# EAGLE design pcb_khamex_zenit_V0.1_rev_5.2 (EAGLE 7.6.0)

## Sheet 1 of 2
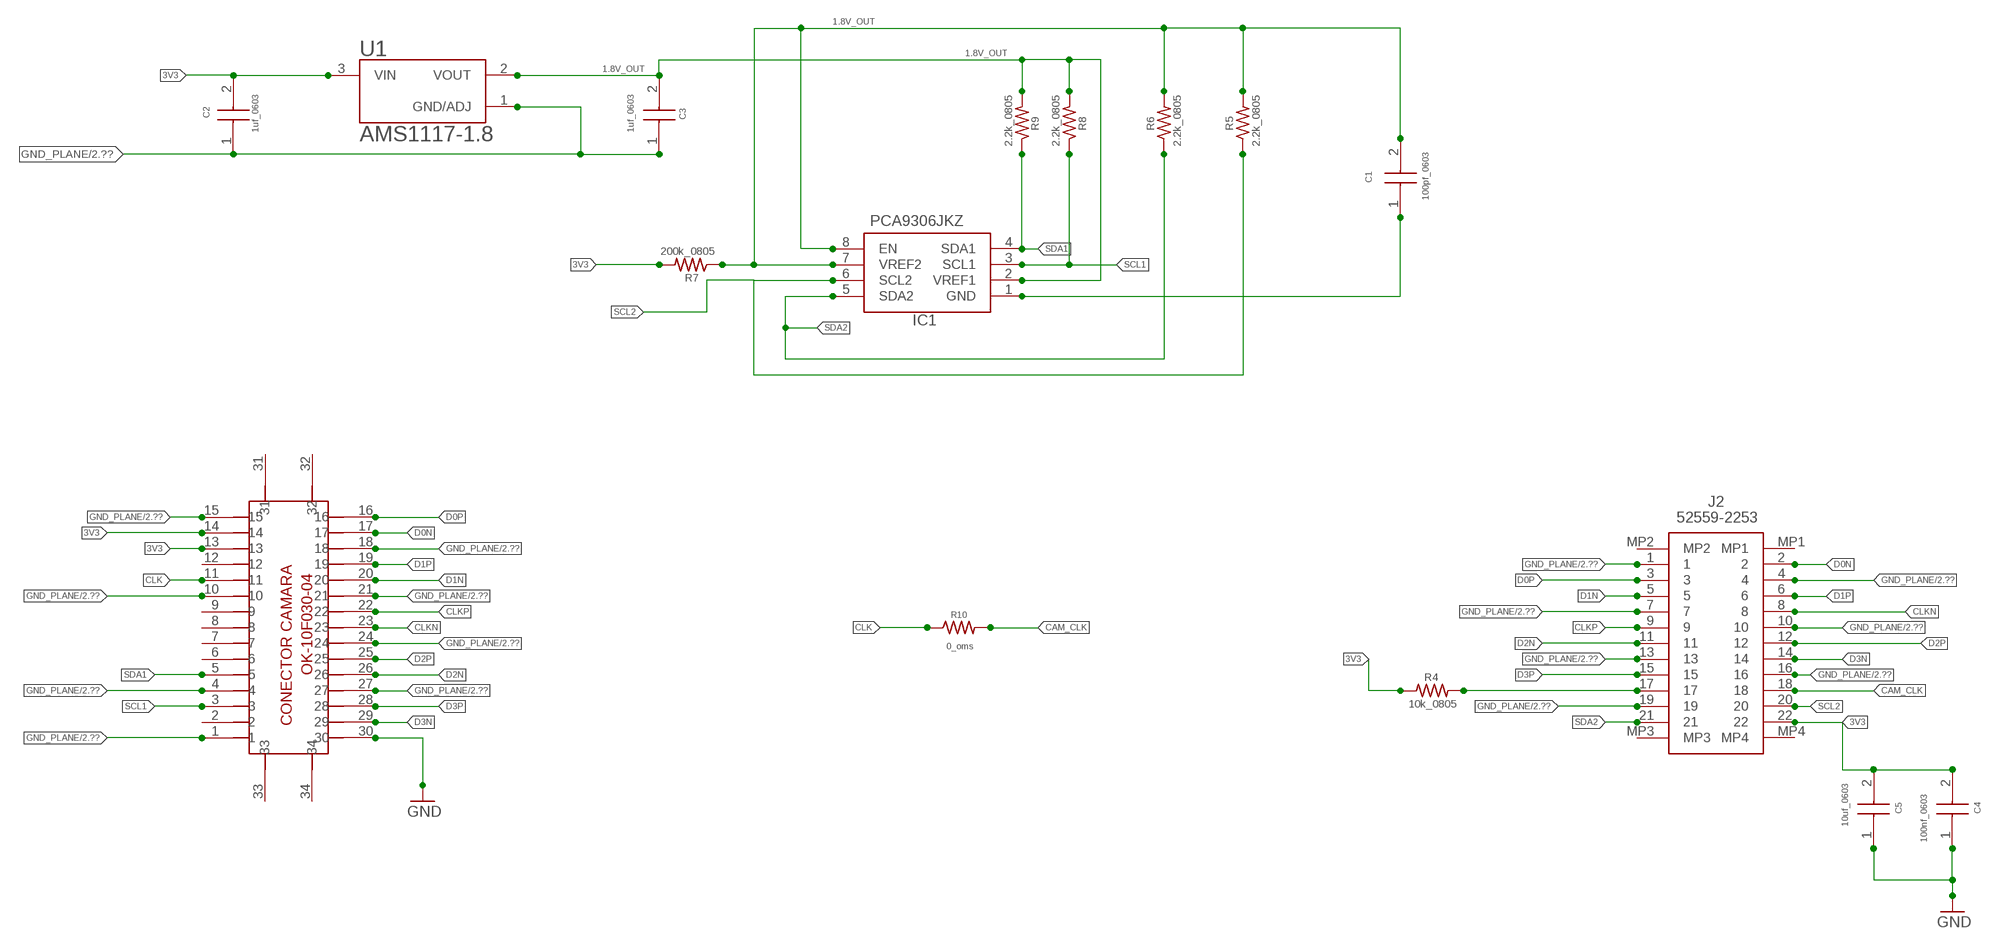
[diagram p0: schematic, sheet 1, part 1 of 2]
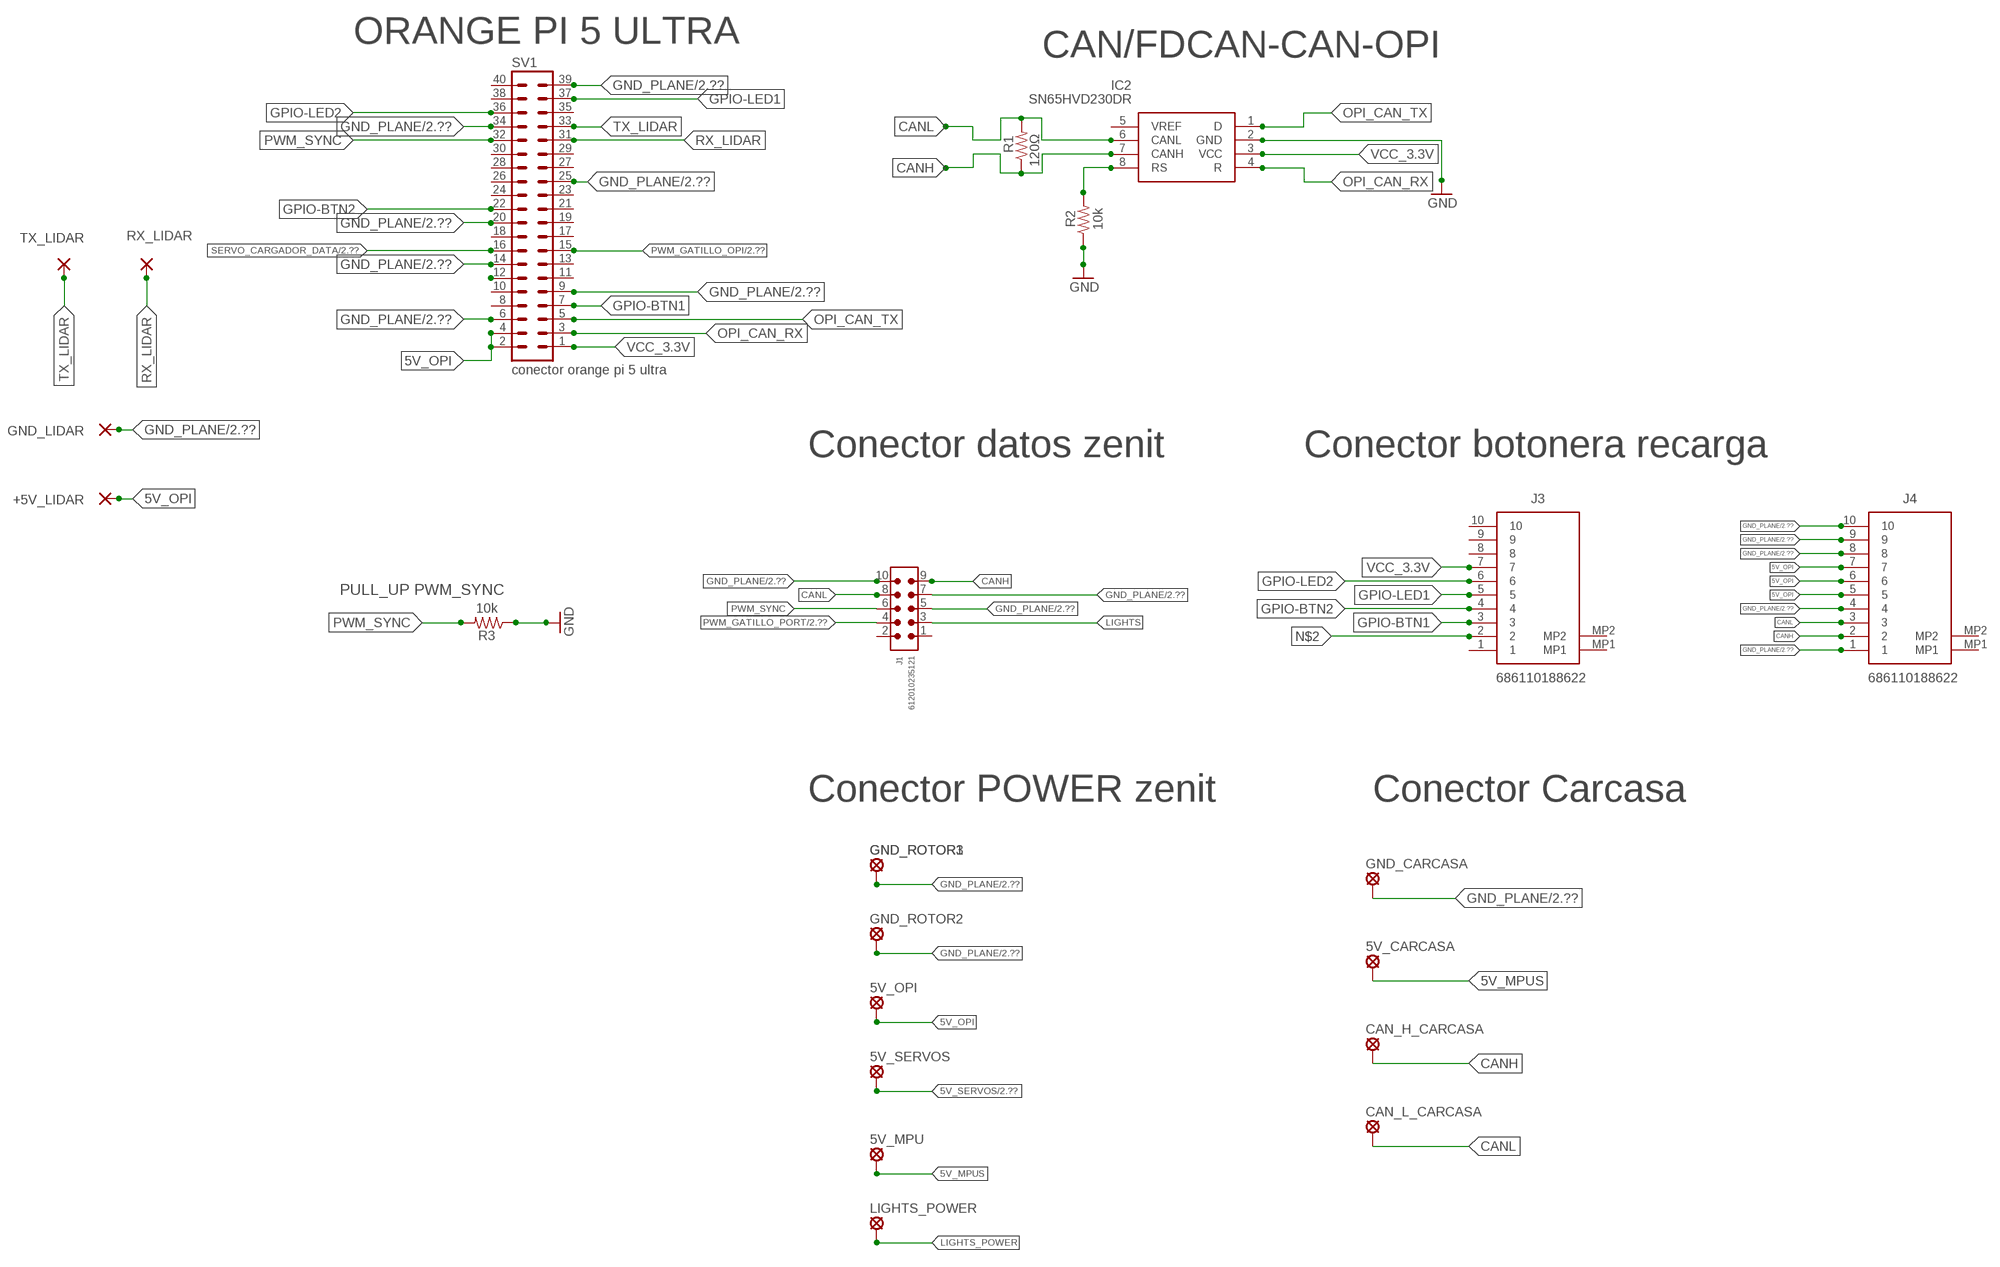
[diagram p1: schematic, sheet 1, part 2 of 2]

### Parts
5V_CARCASA  SE14  [SE14]
5V_MPU  SE14  [SE14]
5V_OPI  SE14  [SE14]
5V_SERVOS  SE14  [SE14]
+5V_LIDAR  WIREPAD1,6/0,8  [1,6/0,8]
C1  100pf_0603  06033U101FAT2A  [CAPC1608X90N]
C2  1uf_0603  06033U101FAT2A  [CAPC1608X90N]
C3  1uf_0603  06033U101FAT2A  [CAPC1608X90N]
C4  100nf_0603  06033U101FAT2A  [CAPC1608X90N]
C5  10uf_0603  06033U101FAT2A  [CAPC1608X90N]
CAN_H_CARCASA  SE14  [SE14]
CAN_L_CARCASA  SE14  [SE14]
GND_CARCASA  SE14  [SE14]
GND_LIDAR  WIREPAD1,6/0,8  [1,6/0,8]
GND_ROTOR1  SE14  [SE14]
GND_ROTOR2  SE14  [SE14]
GND_ROTOR3  SE14  [SE14]
IC1  PCA9306JKZ  [PCA9306JKZ]
IC2  SN65HVD230DR  [SOT127P600X175-8N]
J1  612010235121  6120XX235121_612010235121  [612010235121]
J2  52559-2253  [525592253]
J3  686110188622  [686110188622]
J4  686110188622  [686110188622]
LIGHTS_POWER  SE14  [SE14]
R1  120Ω  R-US_M0805  [M0805]
R2  10k  R-US_M0805  [M0805]
R3  10k  R-US_R0603  [R0603]
R4  10k_0805  R-US_M0805  [M0805]
R5  2.2k_0805  R-US_M0805  [M0805]
R6  2.2k_0805  R-US_M0805  [M0805]
R7  200k_0805  R-US_M0805  [M0805]
R8  2.2k_0805  R-US_M0805  [M0805]
R9  2.2k_0805  R-US_M0805  [M0805]
R10  0_oms  R-US_M0805  [M0805]
RX_LIDAR  WIREPAD1,6/0,8  [1,6/0,8]
SV1  conector orange pi 5 ultra  MA20-2  [MA20-2]
TX_LIDAR  WIREPAD1,6/0,8  [1,6/0,8]
U1  AMS1117-1.8  [SOT229P700X180-4N]
U$1  OK-10F030-04_DEVICE  [OK-10F030-04_PACKAGE]

### Nets
1.8V: C3.2 IC1.2(VREF1) R8.2 R9.2 U1.2(VOUT)
3V3 [power]: C2.2 C4.2 C5.2 J2.22 R4.1 R7.2 U1.3(VIN) U$1.13 U$1.14
5V_MPUS: 5V_CARCASA.MP 5V_MPU.MP
5V_OPI: 5V_OPI.MP +5V_LIDAR.1(P) J4.5 J4.6 J4.7 SV1.2 SV1.4
5V_SERVOS: 5V_SERVOS.MP ; also sheet 2
CAM_CLK: J2.18 R10.2
CANH: CAN_H_CARCASA.MP IC2.7(CANH) J1.9 J4.2 R1.1
CANL: CAN_L_CARCASA.MP IC2.6(CANL) J1.8 J4.3 R1.2
CLK: R10.1 U$1.11
CLKN: J2.8 U$1.23
CLKP: J2.9 U$1.22
D0N: J2.2 U$1.17
D0P: J2.3 U$1.16
D1N: J2.5 U$1.20
D1P: J2.6 U$1.19
D2N: J2.11 U$1.26
D2P: J2.12 U$1.25
D3N: J2.14 U$1.29
D3P [power]: J2.15 U$1.28
GND_PLANE [power]: C2.1 C3.1 C4.1 C5.1 GND_CARCASA.MP GND_LIDAR.1(P) GND_ROTOR1.MP GND_ROTOR2.MP GND_ROTOR3.MP IC2.2(GND) J1.5 J1.7 J1.10 J2.1 J2.4 J2.7 J2.10 J2.13 J2.16 J2.19 J4.1 J4.4 J4.8 J4.9 J4.10 R2.1 R3.1 SV1.6 SV1.9 SV1.14 SV1.20 SV1.25 SV1.34 SV1.39 U1.1(GND/ADJ) U$1.1 U$1.4 U$1.10 U$1.15 U$1.18 U$1.21 U$1.24 U$1.27 U$1.30 ; supply symbol labelled GND ; also sheet 2
GPIO-BTN1: J3.3 SV1.7
GPIO-BTN2: J3.4 SV1.22
GPIO-LED1: J3.5 SV1.37
GPIO-LED2: J3.6 SV1.36
LIGHTS [power]: J1.3
LIGHTS_POWER [power]: LIGHTS_POWER.MP
N$1: C1.1 IC1.1(GND)
N$2: J3.2
N$6: C1.2 IC1.7(VREF2) IC1.8(EN) R5.2 R6.2 R7.1
N$7: J2.17 R4.2
N$9: SV1.12
N$15: IC2.8(RS) R2.2
OPI_CAN_RX: IC2.4(R) SV1.3
OPI_CAN_TX: IC2.1(D) SV1.5
PWM_GATILLO_OPI: SV1.15 ; also sheet 2
PWM_GATILLO_PORT: J1.4 ; also sheet 2
PWM_SYNC: J1.6 R3.2 SV1.32
RX_LIDAR: RX_LIDAR.1(P) SV1.31
SCL1: IC1.3(SCL1) R8.1 U$1.3
SCL2: IC1.6(SCL2) J2.20 R5.1
SDA1: IC1.4(SDA1) R9.1 U$1.5
SDA2: IC1.5(SDA2) J2.21 R6.1
SERVO_CARGADOR_DATA: SV1.16 ; also sheet 2
TX_LIDAR: SV1.33 TX_LIDAR.1(P)
VCC_3.3V: IC2.3(VCC) J3.7 SV1.1
Unconnected: IC2.5(VREF) J1.1 J1.2 J2.MP1 J2.MP2 J2.MP3 J2.MP4 J3.1 J3.8 J3.9 J3.10 J3.MP1 J3.MP2 J4.MP1 J4.MP2 SV1.8 SV1.10 SV1.11 SV1.13 SV1.17 SV1.18 SV1.19 SV1.21 SV1.23 SV1.24 SV1.26 SV1.27 SV1.28 SV1.29 SV1.30 SV1.35 SV1.38 SV1.40 U$1.2 U$1.6 U$1.7 U$1.8 U$1.9 U$1.12 U$1.31 U$1.32 U$1.33 U$1.34

### Notes on the sheet
- 1.8V_OUT
- 1.8V_OUT
- 1.8V_OUT
- ORANGE PI 5 ULTRA
- CAN/FDCAN-CAN-OPI
- Conector datos zenit | Conector botonera recarga
- PULL_UP PWM_SYNC
- Conector POWER zenit | Conector Carcasa

## Sheet 2 of 2
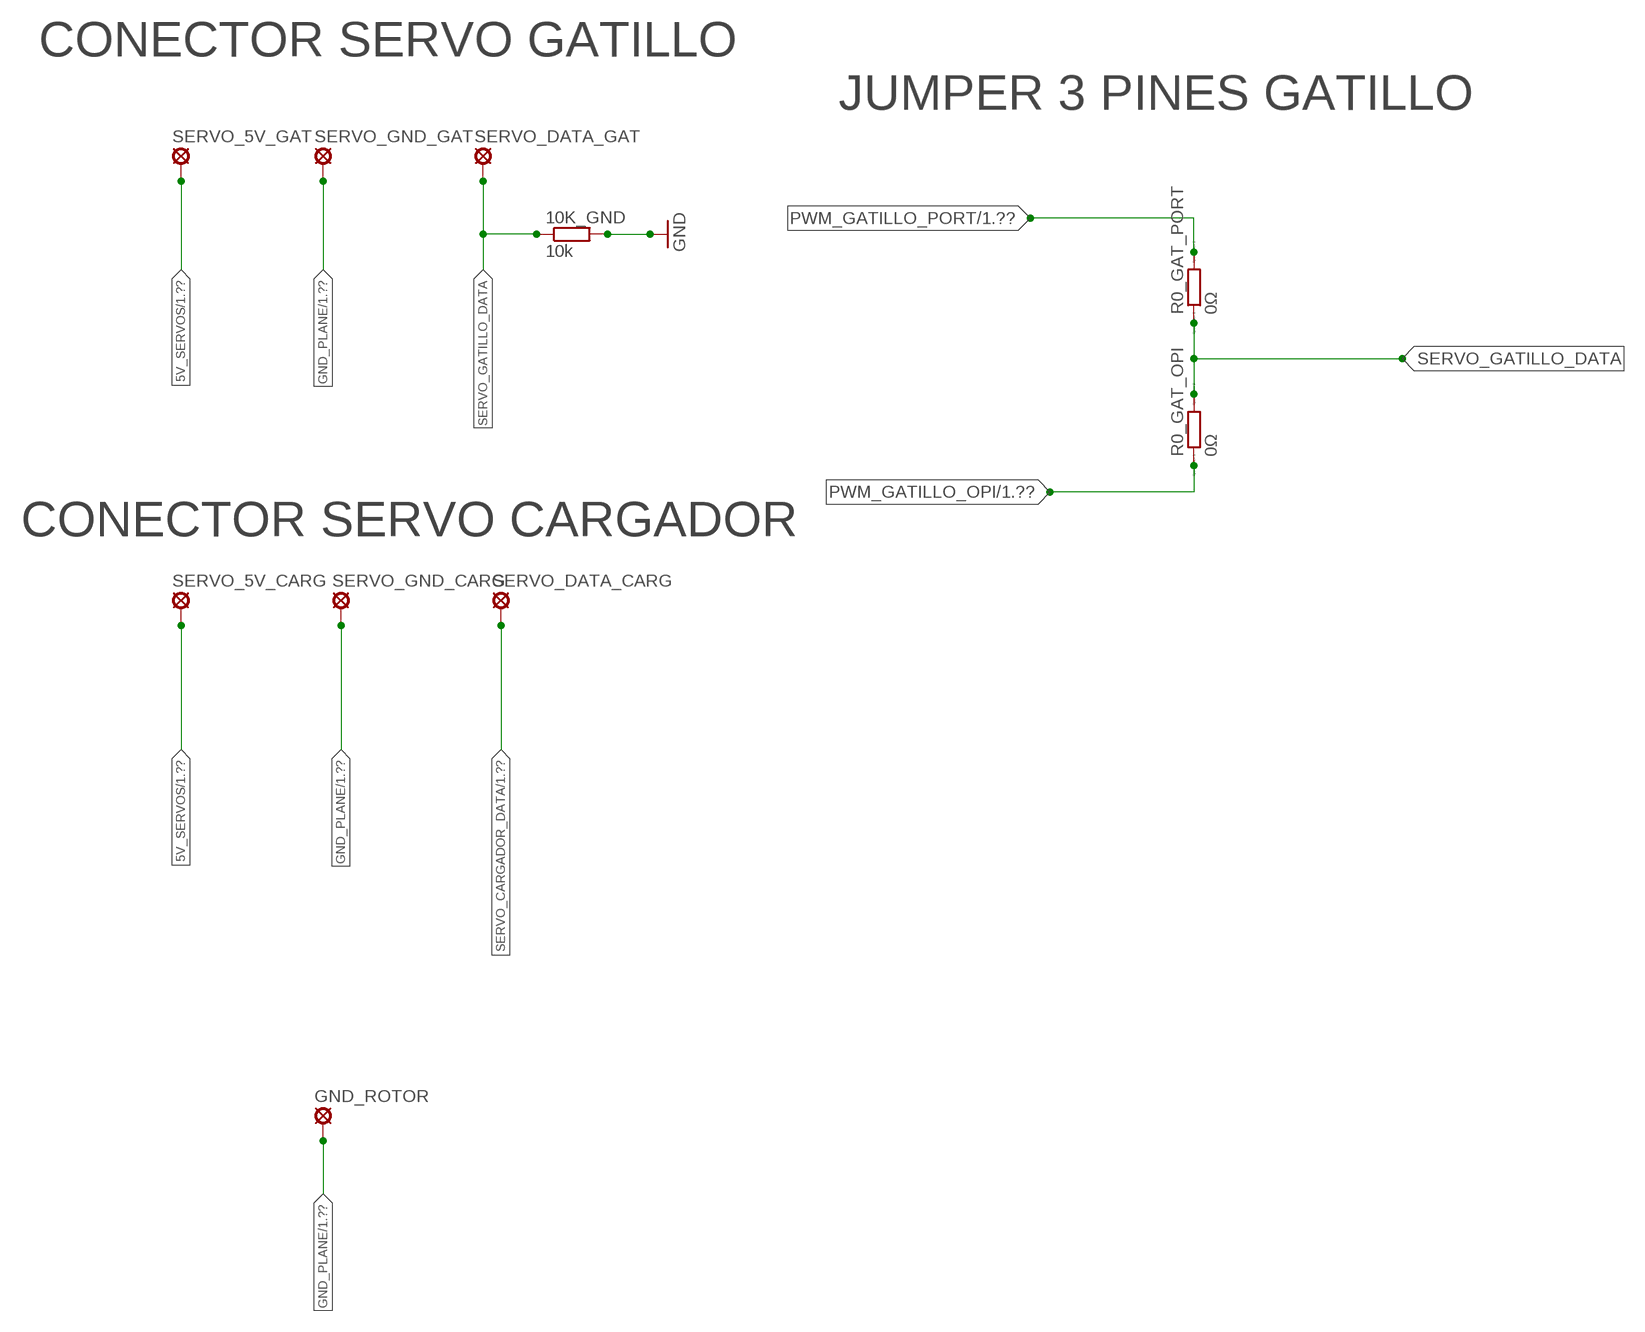
[diagram p2: schematic, sheet 2]

### Parts
10K_GND  10k  R-EU_R0603  [R0603]
GND_ROTOR  SE14  [SE14]
R0_GAT_OPI  0Ω  RR0603  [R0603]
R0_GAT_PORT  0Ω  RR0603  [R0603]
SERVO_5V_CARG  SE14  [SE14]
SERVO_5V_GAT  SE14  [SE14]
SERVO_DATA_CARG  SE14  [SE14]
SERVO_DATA_GAT  SE14  [SE14]
SERVO_GND_CARG  SE14  [SE14]
SERVO_GND_GAT  SE14  [SE14]

### Nets
5V_SERVOS: SERVO_5V_CARG.MP SERVO_5V_GAT.MP ; also sheet 1
GND_PLANE [power]: 10K_GND.2 GND_ROTOR.MP SERVO_GND_CARG.MP SERVO_GND_GAT.MP ; supply symbol labelled GND ; also sheet 1
PWM_GATILLO_OPI: R0_GAT_OPI.1 ; also sheet 1
PWM_GATILLO_PORT: R0_GAT_PORT.2 ; also sheet 1
SERVO_CARGADOR_DATA: SERVO_DATA_CARG.MP ; also sheet 1
SERVO_GATILLO_DATA: 10K_GND.1 R0_GAT_OPI.2 R0_GAT_PORT.1 SERVO_DATA_GAT.MP

### Notes on the sheet
- CONECTOR SERVO GATILLO
- JUMPER 3 PINES GATILLO
- CONECTOR SERVO CARGADOR

## Library data of the parts
5V_CARCASA 5V_MPU 5V_OPI 5V_SERVOS CAN_H_CARCASA CAN_L_CARCASA GND_CARCASA GND_ROTOR GND_ROTOR1-GND_ROTOR3 LIGHTS_POWER SERVO_5V_CARG SERVO_5V_GAT SERVO_DATA_CARG SERVO_DATA_GAT SERVO_GND_CARG SERVO_GND_GAT = solpad:SE14: SOLDER PAD E1553, drill 1,4mm, distributor Buerklin, 07F820
10K_GND = rcl_dani:R-EU_: RESISTOR, European symbol
+5V_LIDAR GND_LIDAR RX_LIDAR TX_LIDAR = wirepad:WIREPAD: Wire PAD connect wire on PCB
C1-C5 = 06033U101FAT2A:06033U101FAT2A: Multilayer Ceramic Capacitors MLCC - SMD/SMT 25V 100pF C0G 0603 1% Tol Source: Datasheet <https://componentsearchengine.com/Datasheets/1/06031A100FAT2A.pdf>; DESCRIPTION: Multilayer Ceramic Capacitors MLCC - SMD/SMT 25V 100pF C0G 0603 1% Tol; HEIGHT: 0.9mm; MANUFACTURER_NAME: Kyocera AVX; MANUFACTURER_PART_NUMBER: 06033U101FAT2A
IC1 = PCA9306JKZ:PCA9306JKZ: Voltage Level Translator Bidirectional 1 Circuit 2 Channel 8-X2SON (1.35x1) , 1.8 V ~ 5.5 V , -40C ~ 105C (TA) Source: Datasheet <https://www.nxp.com/docs/en/data-sheet/PCA9306.pdf>; DESCRIPTION: Voltage Level Translator Bidirectional 1 Circuit 2 Channel 8-X2SON (1.35x1) , 1.8 V ~ 5.5 V , -40C ~ 105C (TA); HEIGHT: 0.33mm; MANUFACTURER_NAME: NXP; MANUFACTURER_PART_NUMBER: PCA9306JKZ
IC2 = SN65HVD230DR:SN65HVD230DR: 3.3 V CAN Transceiver with Standby Mode Source: Datasheet <http://www.ti.com/lit/gpn/sn65hvd230>; DESCRIPTION: 3.3 V CAN Transceiver with Standby Mode; HEIGHT: 1.75mm; MANUFACTURER_NAME: Texas Instruments; MANUFACTURER_PART_NUMBER: SN65HVD230DR; MOUSER_PART_NUMBER: 595-SN65HVD230DR; MOUSER_PRICE-STOCK: https://www.mouser.co.uk/ProductDetail/Texas-Instruments/SN65HVD230DR?qs=QViXGNcIEAtifeQR3pYVUQ%3D%3D
J1 = Eagle_WR-BHD_rev24a:6120XX235121_612010235121: WR-BHD 2.54 mm Male Box Header High Temperature KIND PROPERTIES: Pitch 2.54 mm Gender:Male MATERIAL PROPERTIES: Insulator Material:PA6T Insulator Flammability Rating UL94 V-0 Insulator Color:Black Contact Material :Copper Alloy Contact Plating :Gold Contact Type: Stamped GENERAL INFORMATION: Operating Temperature:-40 °C up to +125 °C Compliance:RoHS Working Voltage: 250 V (AC) Withstanding Voltage:500 V (AC) Contact Resistance: 20 mΩ Insulation Resistance:1000 MΩ PACKAGING PROPERTIES Packaging :Tray <https://www.we-online.com/catalog/media/o32904v209%20Family_WR-BHD_6120xx235121.jpg> Details see: https://www.we-online.com/catalog/en/BHD_2_54_MALE_BOX_HEADER_HIGH_TEMPERATURE_6120XX235121 Updated by Ella Wu 2021-03-12 2021 (C) Würth Elektronik; CONTACT-RESISTANCE: 20mOhm; DATASHEET-URL: https://www.we-online.com/redexpert/spec/612010235121?ae; GENDER: Male; IR: 3A; LENGTH: 20.3mm; MOUNT: THT; PACKAGING: Tray; PART-NUMBER: 612010235121; PINS: 10; PITCH: 2.54mm; TYPE: Straight; WORKING-VOLTAGE: 250V(AC)
J2 = 52559-2253:52559-2253: 0.5 MM FPC CONNECTOR Source: Datasheet; DESCRIPTION: 0.5 MM FPC CONNECTOR; HEIGHT: 5.55mm; MANUFACTURER_NAME: Molex; MANUFACTURER_PART_NUMBER: 52559-2253; MOUSER_PART_NUMBER: 538-52559-2253; MOUSER_PRICE-STOCK: https://www.mouser.co.uk/ProductDetail/Molex/52559-2253?qs=nDwhpid8gJaCOR81Wp3jsw%3D%3D
J3 J4 = 686110188622:686110188622: FFC & FPC Connectors WR-FPC 1,0mm SMT Horiz. Top Contact Tin Plating{0000} Source: Datasheet <https://www.mouser.ch/datasheet/2/445/686110188622-1843591.pdf>; DESCRIPTION: FFC & FPC Connectors WR-FPC 1,0mm SMT Horiz. Top Contact Tin Plating{0000}; HEIGHT: 3.3mm; MANUFACTURER_NAME: Wurth Elektronik; MANUFACTURER_PART_NUMBER: 686110188622; MOUSER_PART_NUMBER: 710-686110188622; MOUSER_PRICE-STOCK: https://www.mouser.co.uk/ProductDetail/Wurth-Elektronik/686110188622?qs=OlC7AqGiEDnHUpT6yh27Lg%3D%3D
R0_GAT_OPI R0_GAT_PORT = eagle-ltspice:R: RESISTOR, European symbol; SPICEMODEL: NONE; SPICEPREFIX: R
R1-R10 = rcl:R-US_: RESISTOR, American symbol
SV1 = con-lstb:MA20-2: PIN HEADER; OC_FARNELL: unknown; OC_NEWARK: unknown
U1 = AMS1117-1.8 (1):AMS1117-1.8: Check availability <https://pricing.snapeda.com/parts/AMS1117-1.8-TR/ams/view-part?ref=eda>; AVAILABILITY: Not in stock; CHECK_PRICES: https://www.snapeda.com/parts/AMS1117-1.8-TR/ams/view-part/?ref=eda; MF: ams; MP: AMS1117-1.8-TR; PACKAGE: SOT-223 Seeed Technology; PRICE: None; SNAPEDA_LINK: https://www.snapeda.com/parts/AMS1117-1.8-TR/ams/view-part/?ref=snap
U$1 = OK-10F030-04_LIBRARY_2:OK-10F030-04_DEVICE: Conector para las camaras del Orange Pi 5 Ultra 30 pines click

## Net classes
0 default: width 0.15 mm, drill 0.3 mm, clearance 0.15 mm
1 power: width 0.127 mm, drill 0.305 mm, clearance 0.127 mm
2 thin: width 0.254 mm, drill 0.254 mm, clearance 0.254 mm
3 mipi: width 0.15 mm, drill 0.2 mm, clearance 0.15 mm

## Board
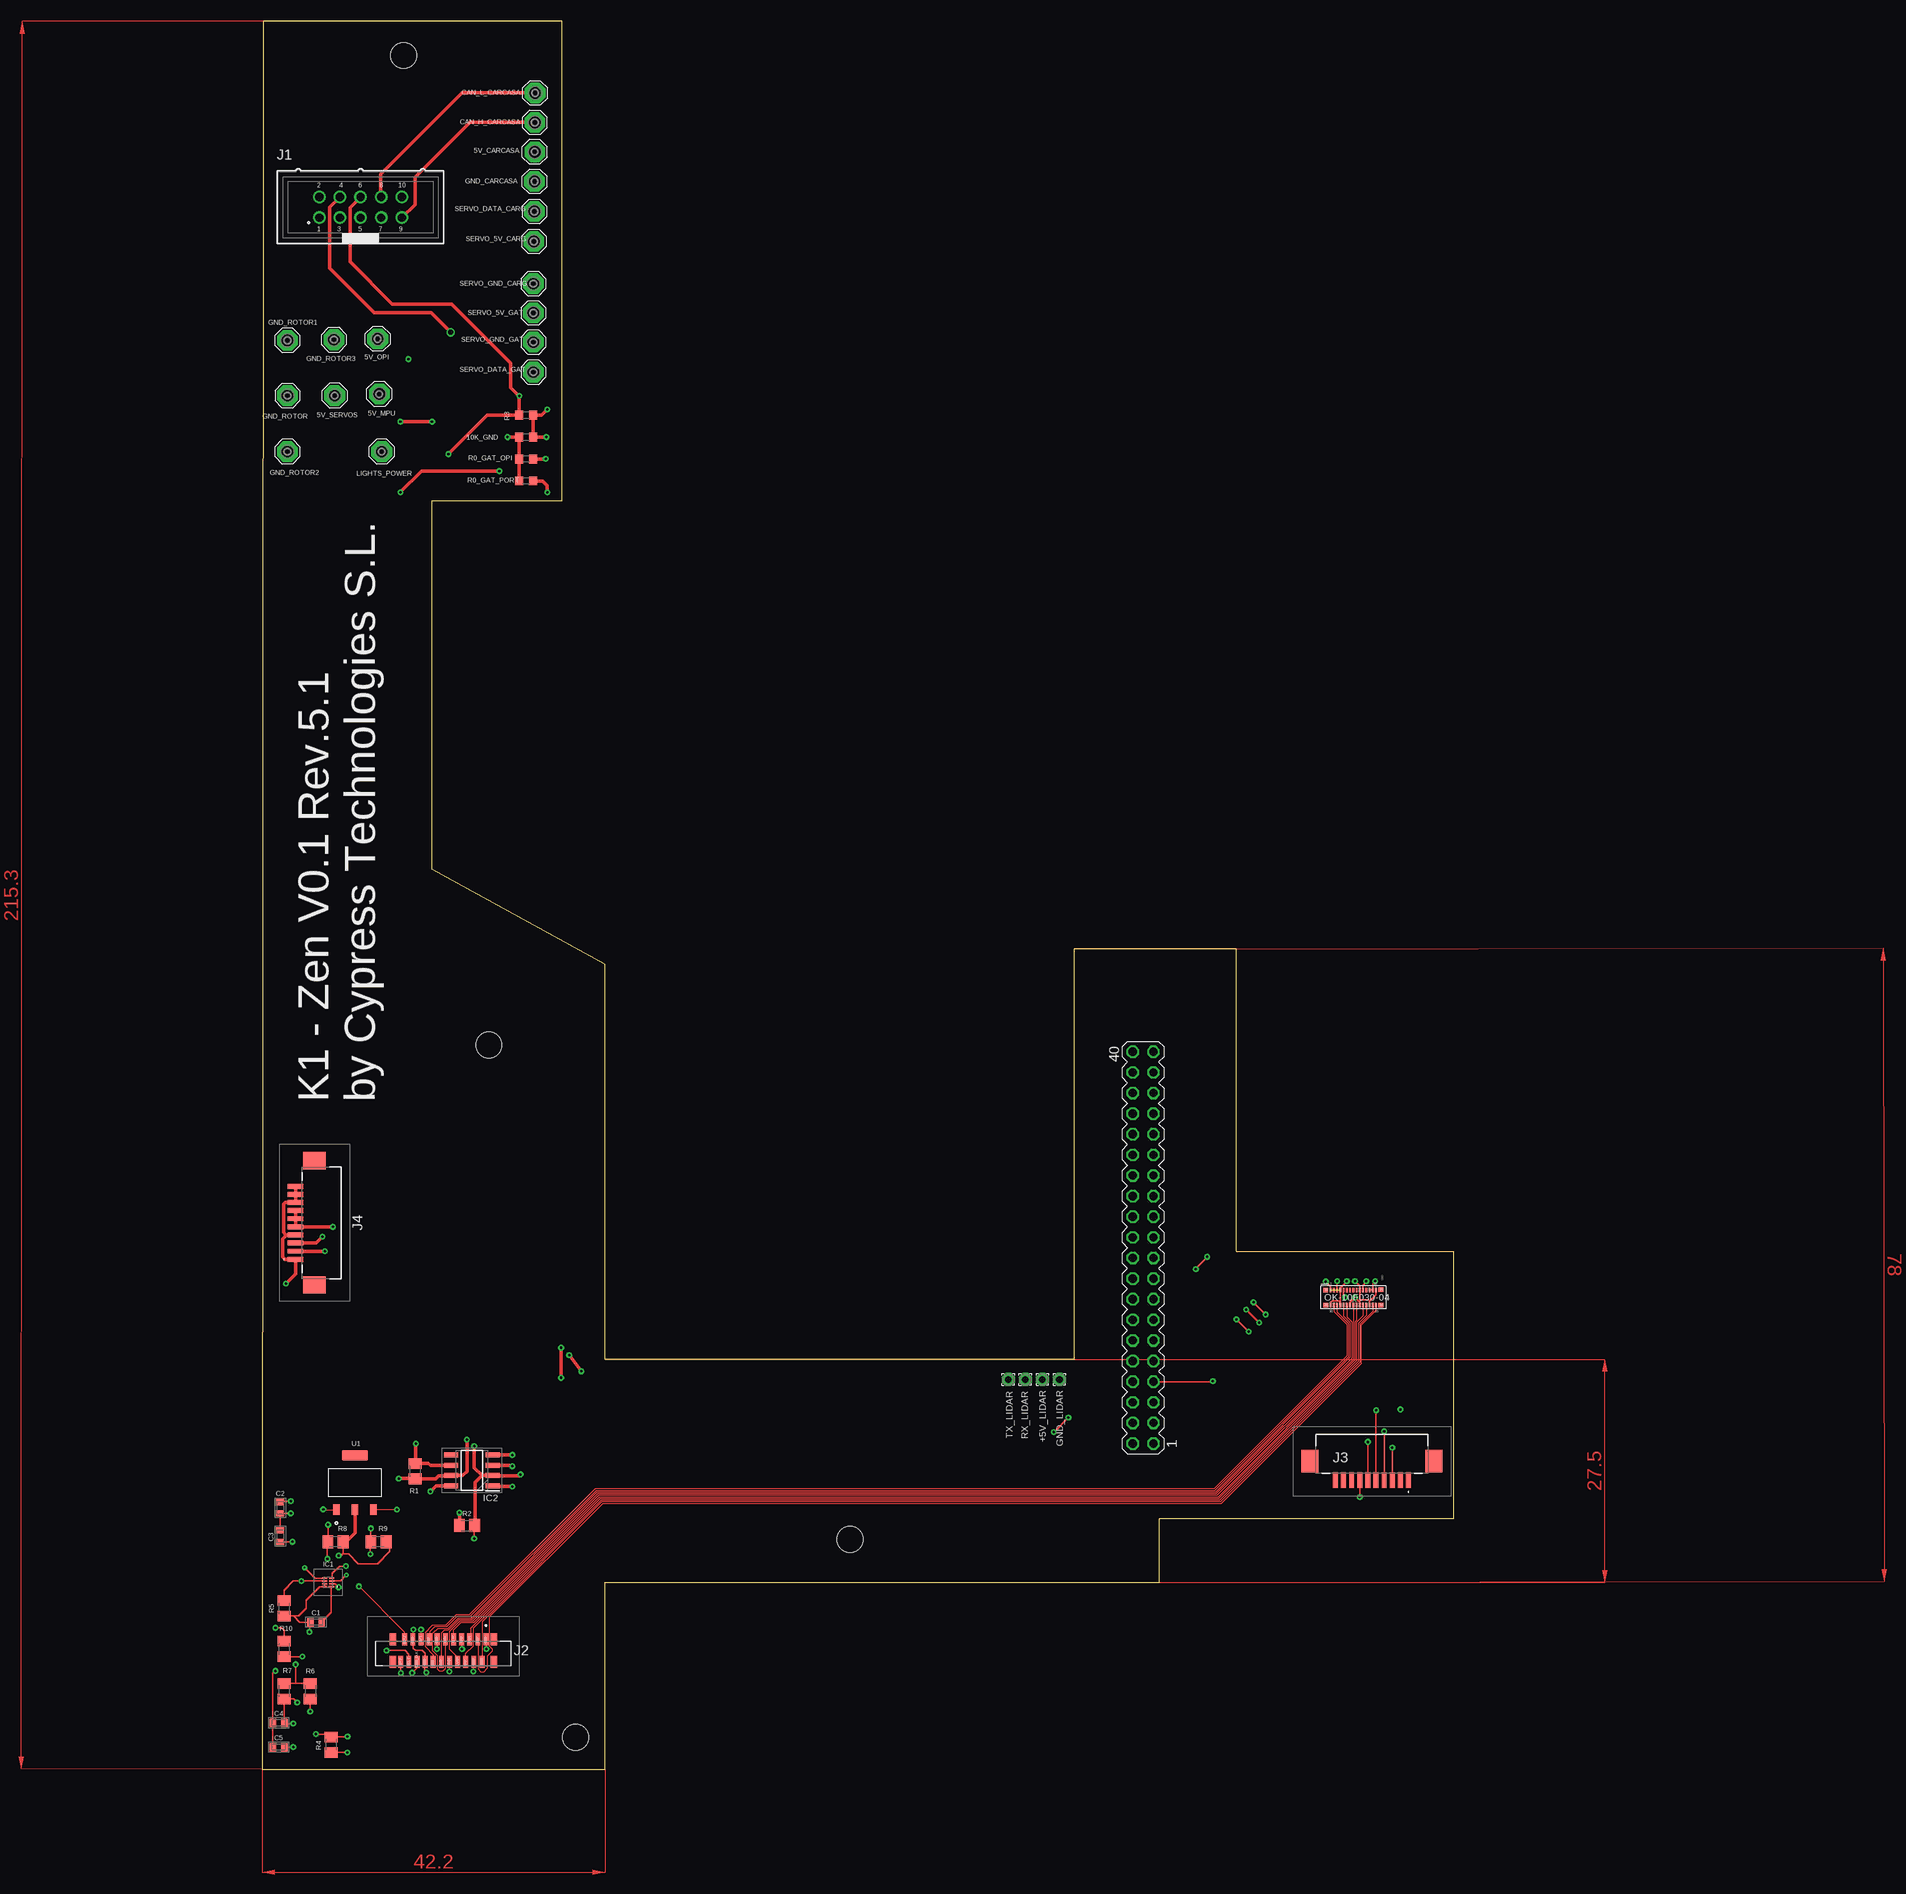
[diagram p3: board, top side]
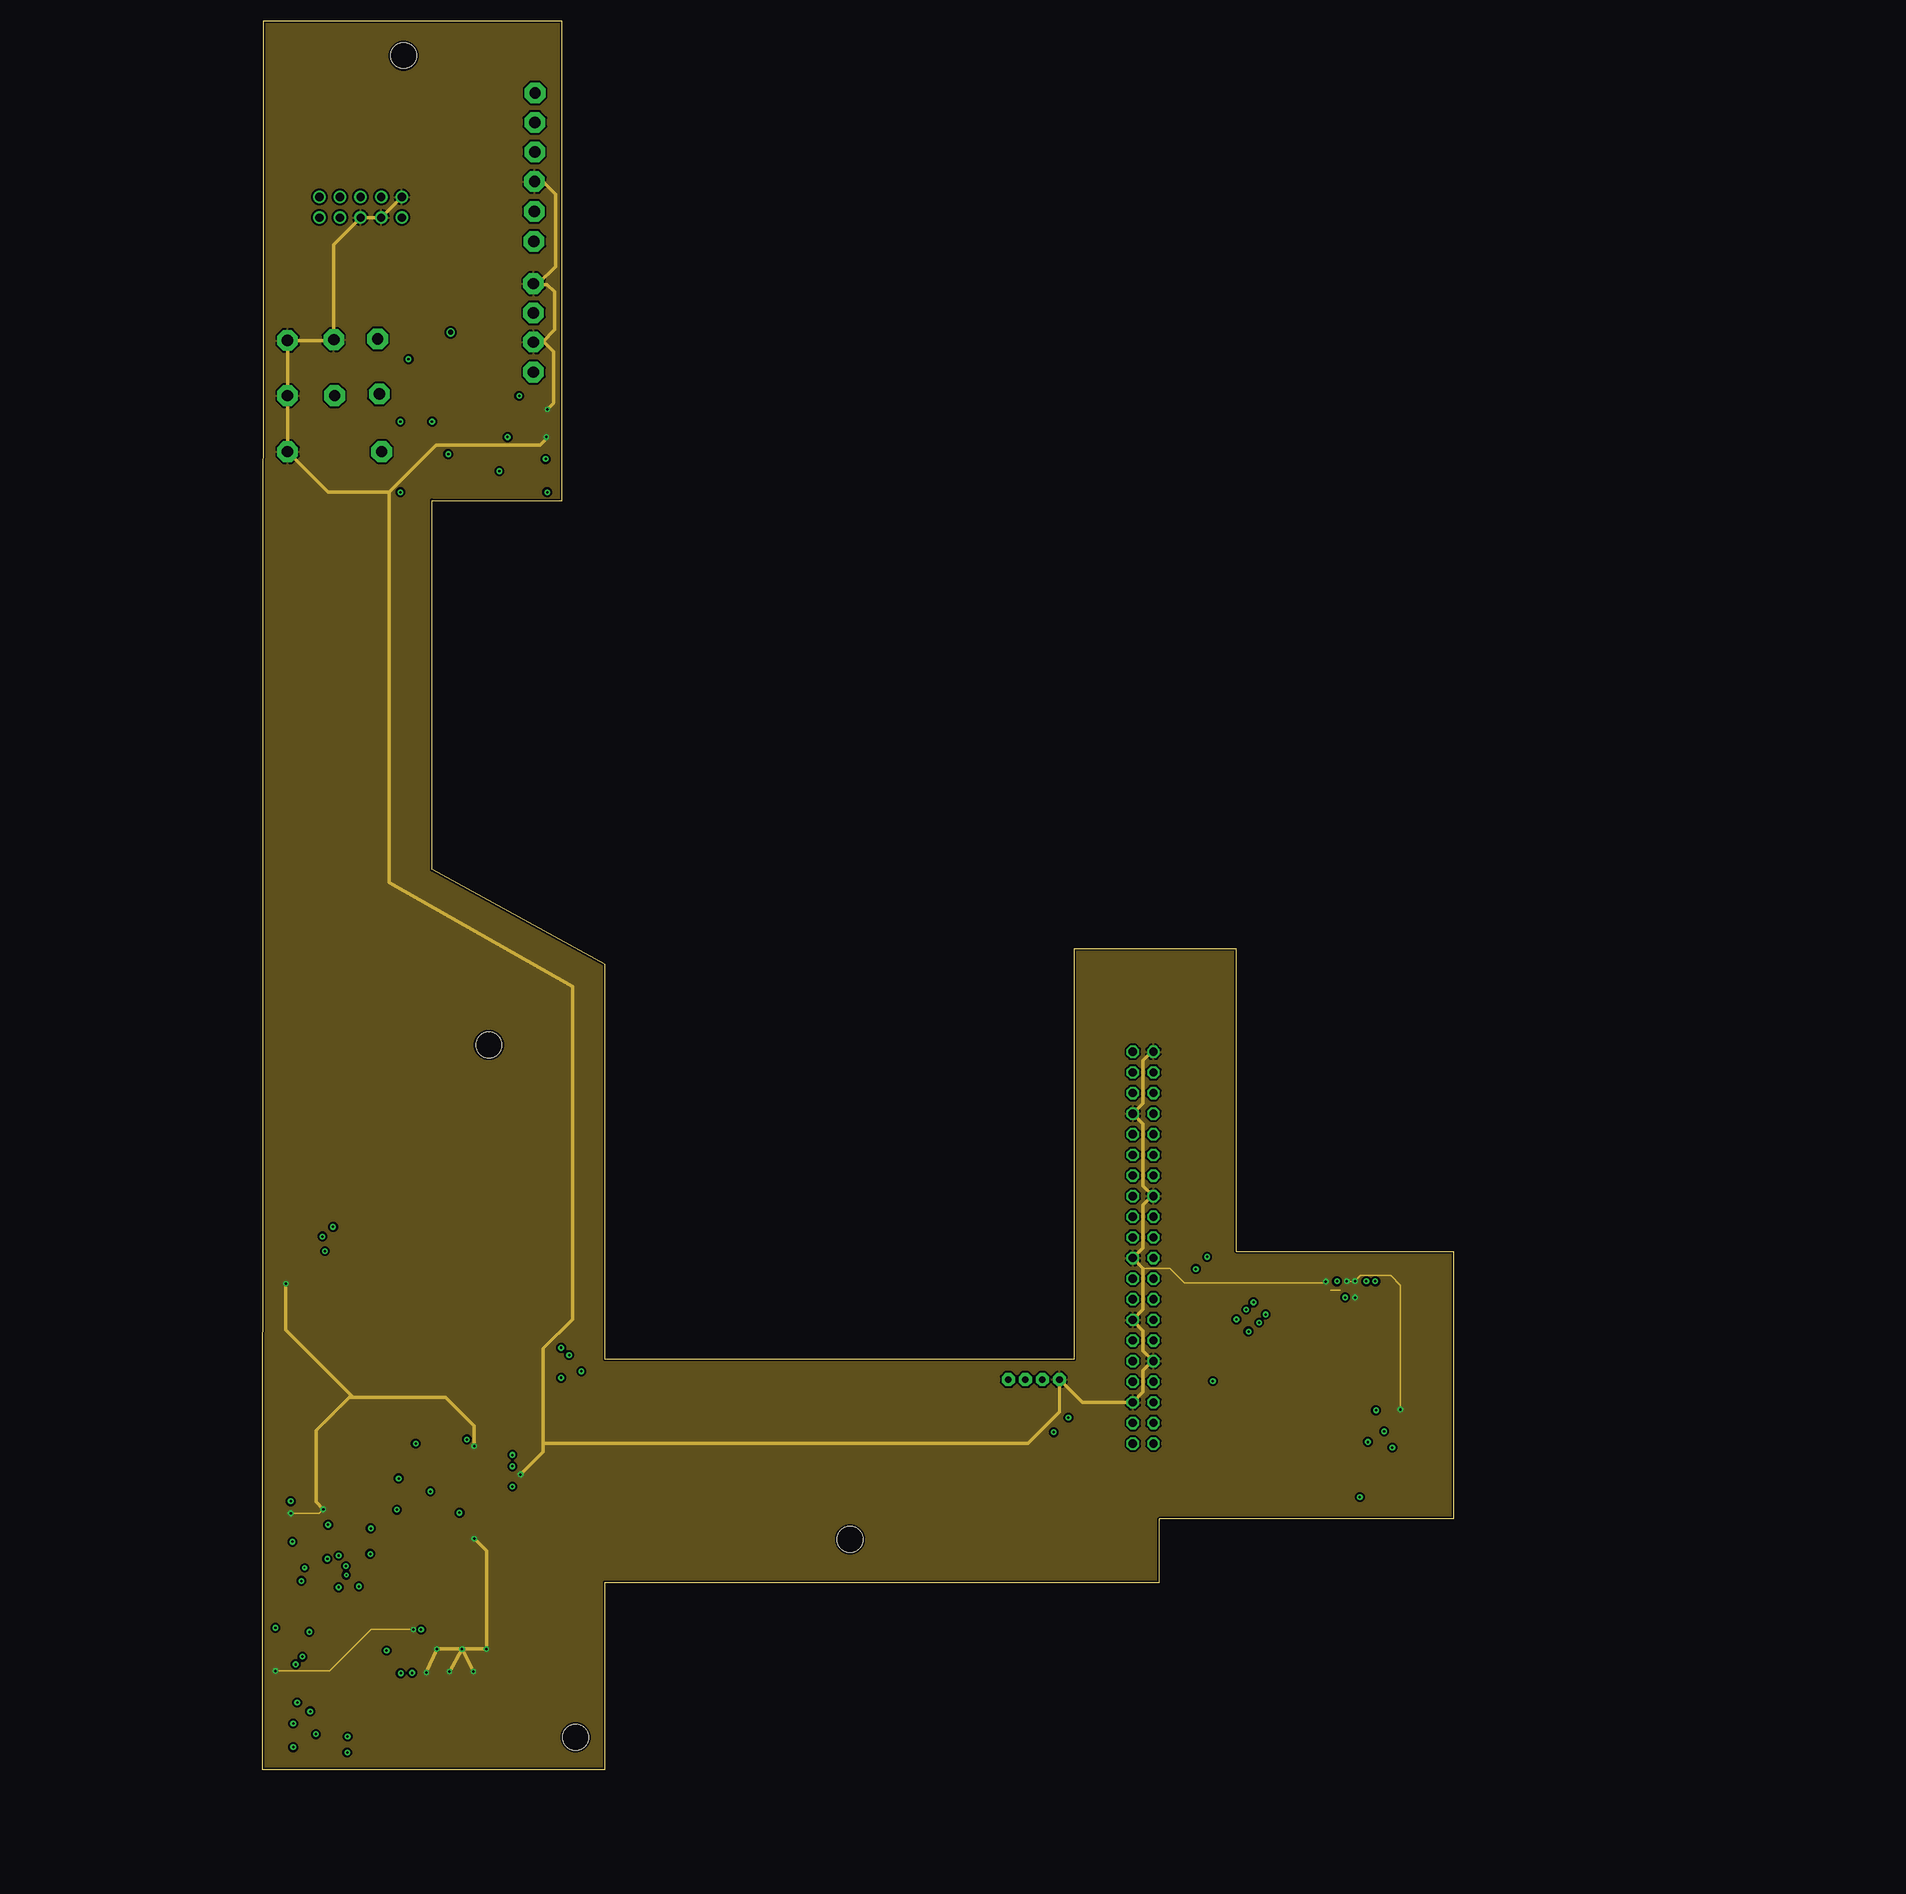
[diagram p4: board, inner layer GND_PLANE]
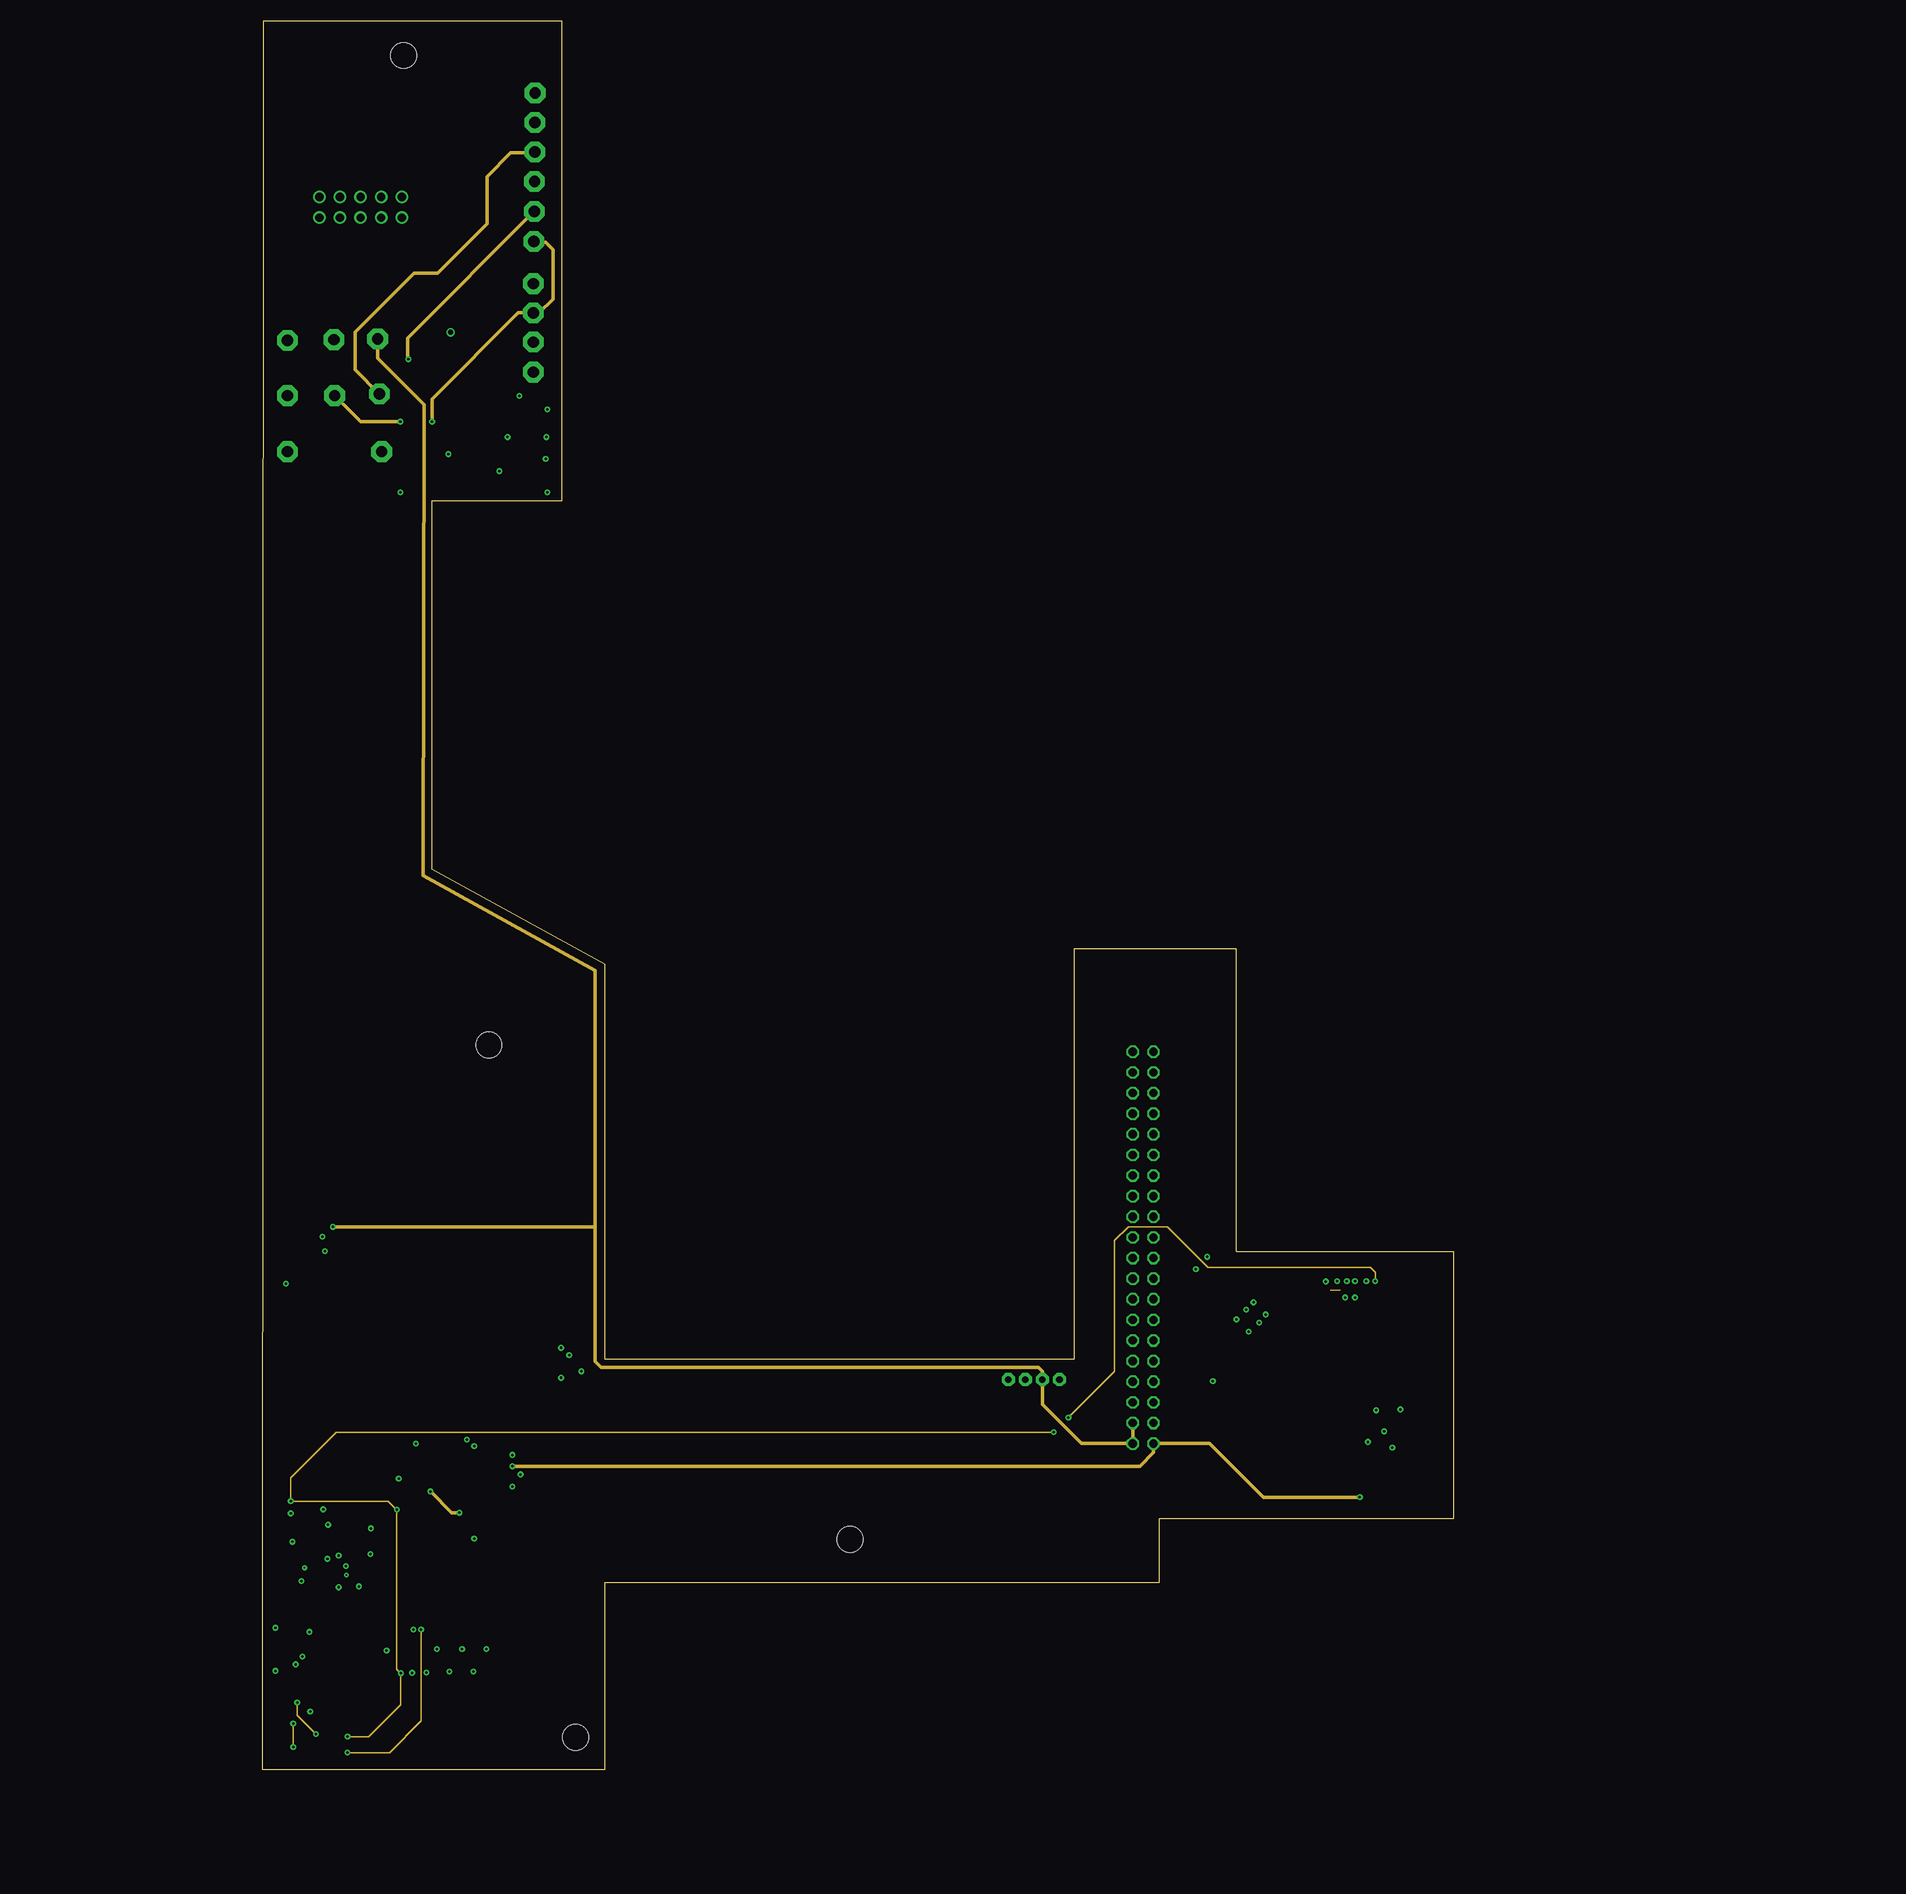
[diagram p5: board, inner layer POWER]
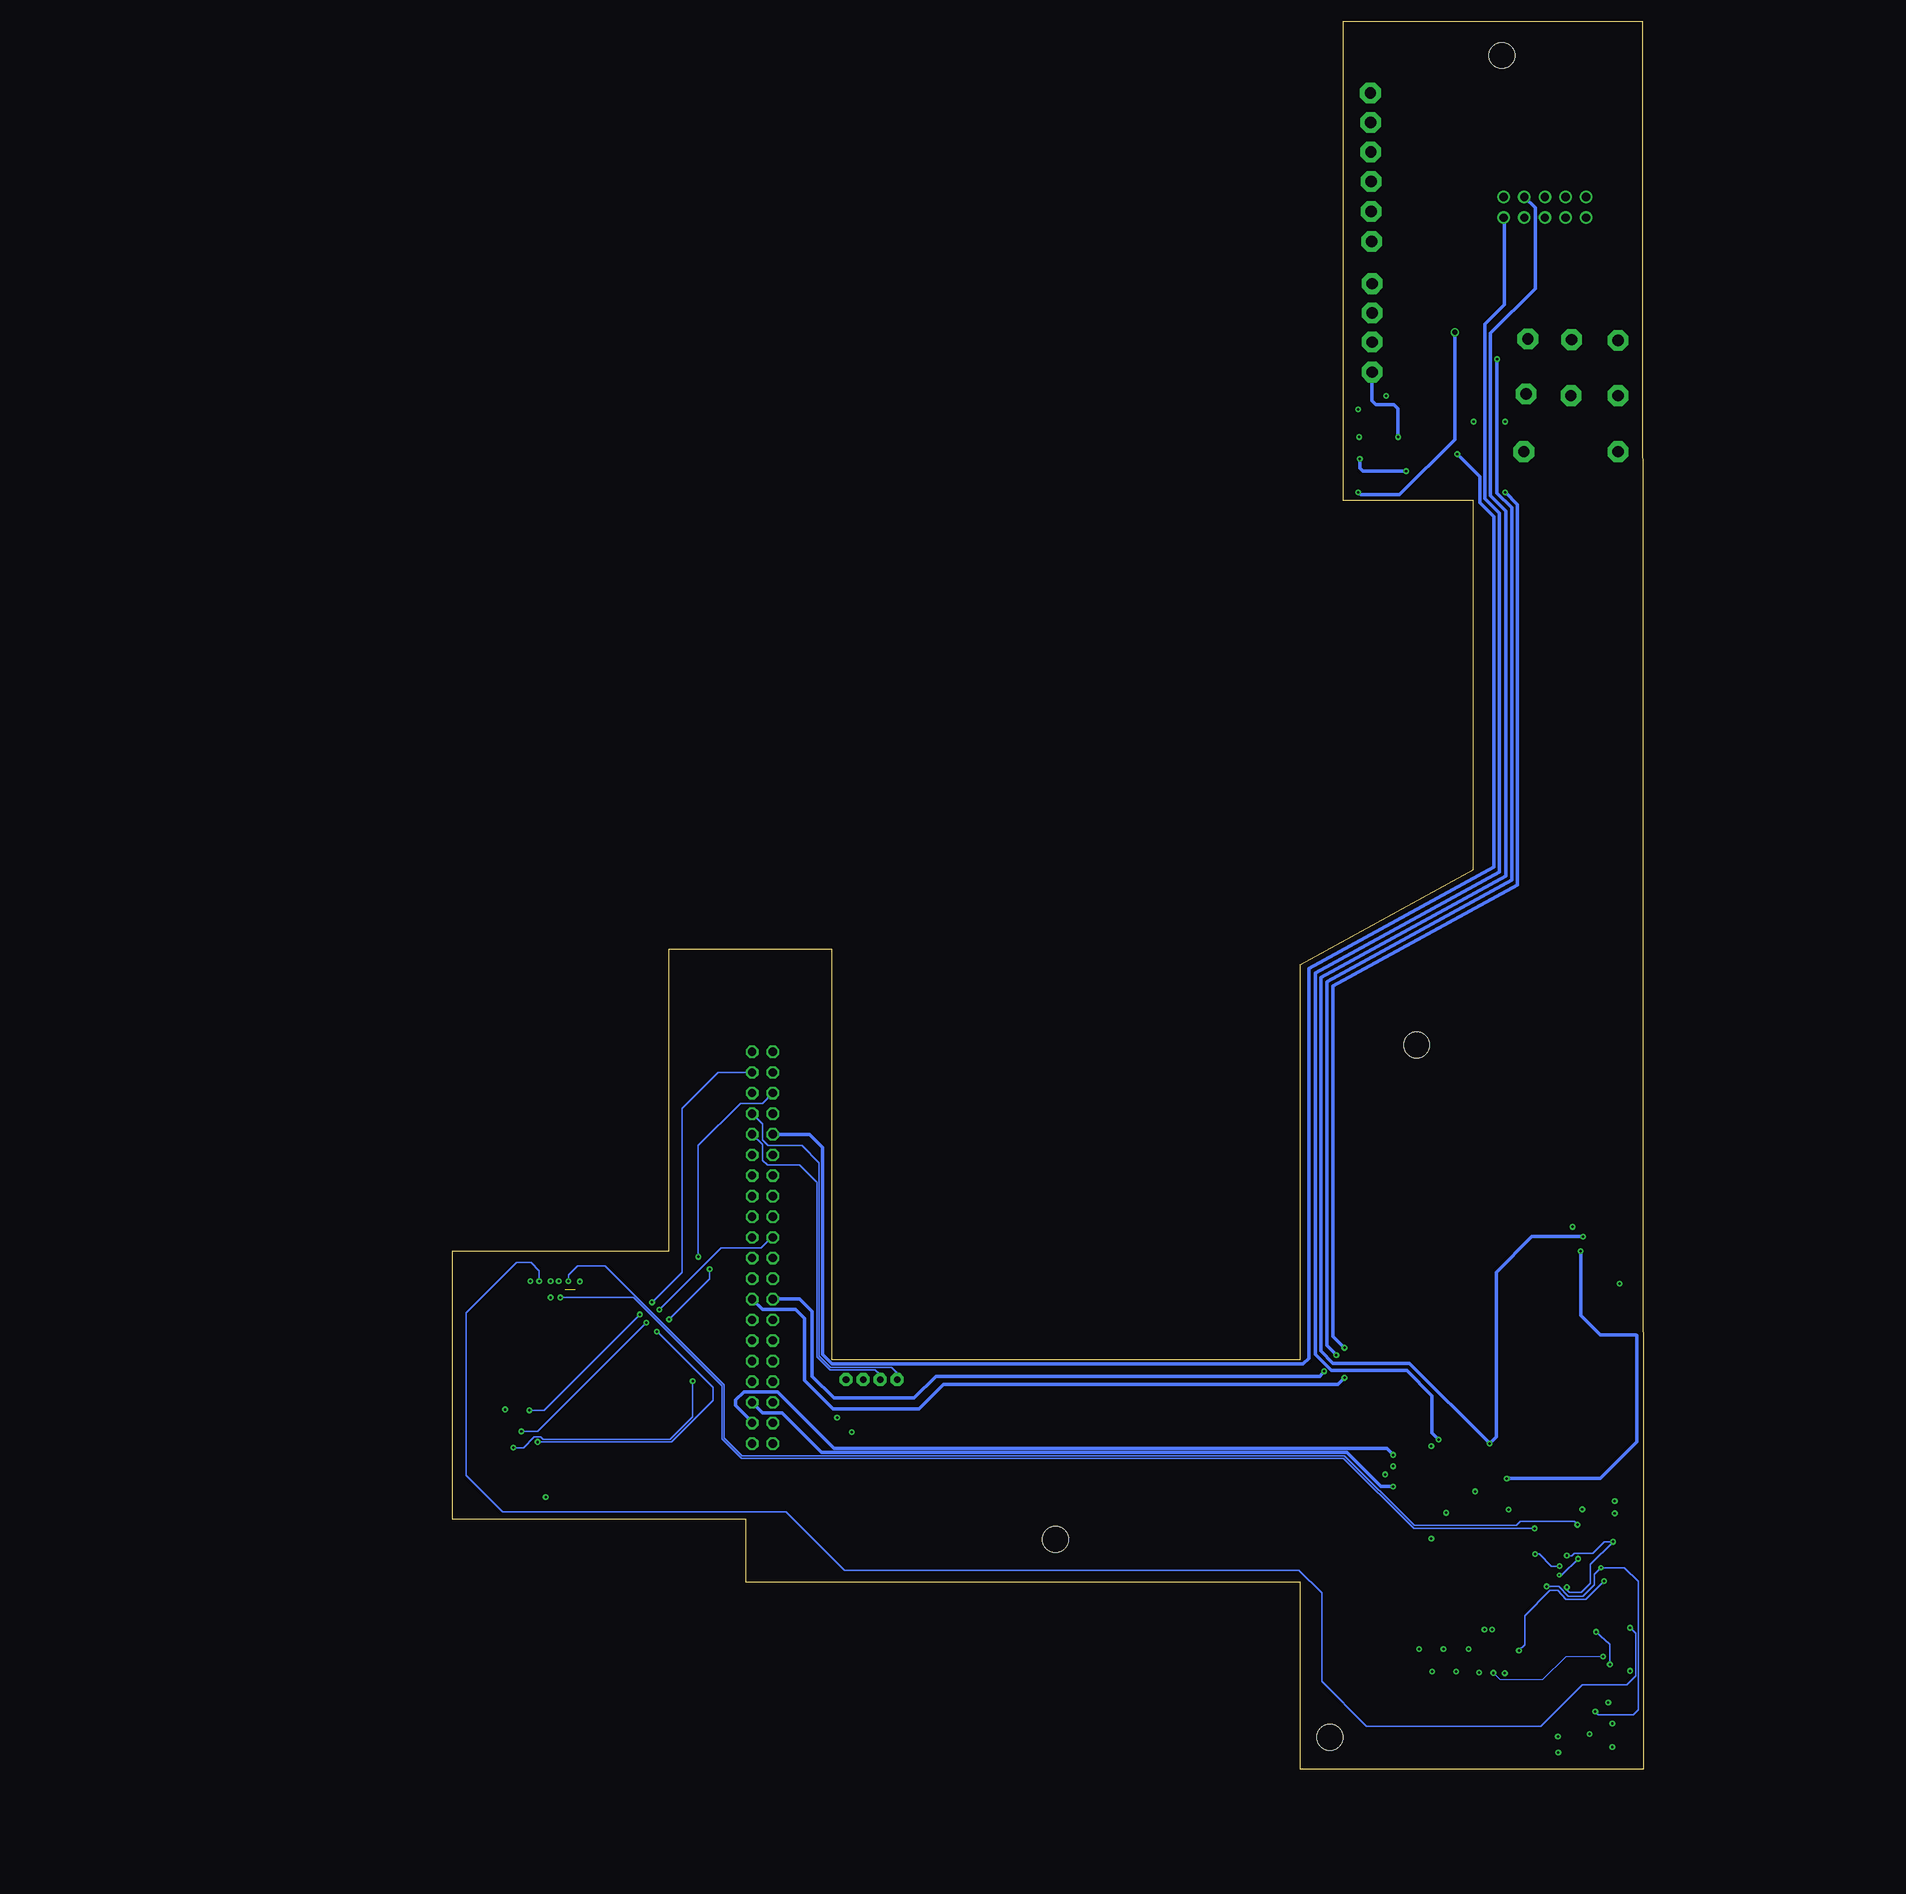
[diagram p6: board, bottom side, seen from below]

Size 146.7 x 215.3 mm. Coordinates in mm from the lower left corner, seen from the top.
Outline: 0,0 42.2,0 42.2,23 110.5,23 110.5,30.8 146.7,30.8 146.7,63.8 120,63.8 120,101 100,101 100,50.5 42.2,50.5 42.2,99.1 20.9,110.8 20.9,156.3 36.9,156.3 36.9,215.3 0.1,215.3 0,0
Copper layers (1*2*15*16): Top 0.035mm / dielectric 1.5mm / GND_PLANE 0.035mm / dielectric 0.15mm / POWER 0.035mm / dielectric 0.2mm / Bottom 0.035mm
Design rules "default *": minimum track width 6mil, minimum drill 8mil, track to track 6mil, track to pad 6mil, pad to pad 6mil, via to via 6mil, smd to smd 0mil, copper to edge 10mil, drill to drill 8mil, minimum pad ring 10mil, minimum via ring 8mil, stop-mask expansion 4mil, vias tented up to drill 0mil, thermal gap 10mil
Holes 3.2 mm at 17.4,211.1 72.4,28.3 38.6,3.9 27.9,89.2

### Footprints (pad centres in the part's own frame; a part is rotated, then mirrored left to right if it is on the bottom)
SE14 = drill 1.397 pad 2.54 octagon: MP 0,0
R0603 = smd 1 x 1.1: 1 -0.85,0; 2 0.85,0
1,6/0,8 = drill 0.813 pad 1.6 octagon: 1 0,0
CAPC1608X90N = smd 0.78 x 0.99: 1 -0.7,0; 2 0.7,0
PCA9306JKZ = smd 0.65 x 0.17: 1 -0.4,0.525 | smd 0.6 x 0.17: 2 -0.425,0.175; 3 -0.425,-0.175; 4 -0.425,-0.525; 5 0.425,-0.525; 6 0.425,-0.175; 7 0.425,0.175; 8 0.425,0.525
SOT127P600X175-8N = smd 1.75 x 0.6: 1 -2.55,1.905; 2 -2.55,0.635; 3 -2.55,-0.635; 4 -2.55,-1.905; 5 2.55,-1.905; 6 2.55,-0.635; 7 2.55,0.635; 8 2.55,1.905
612010235121 = drill 1.02: 1 -5.08,-1.27; 2 -5.08,1.27; 3 -2.54,-1.27; 4 -2.54,1.27; 5 0,-1.27; 6 0,1.27; 7 2.54,-1.27; 8 2.54,1.27; 9 5.08,-1.27; 10 5.08,1.27
525592253 = smd 0.6 x 1.5: 1 -5.25,-1.4; 2 -4.75,1.4; 3 -4.25,-1.4; 4 -3.75,1.4; 5 -3.25,-1.4; 6 -2.75,1.4; 7 -2.25,-1.4; 8 -1.75,1.4; 9 -1.25,-1.4; 10 -0.75,1.4; 11 -0.25,-1.4; 12 0.25,1.4; 13 0.75,-1.4; 14 1.25,1.4; 15 1.75,-1.4; 16 2.25,1.4; 17 2.75,-1.4; 18 3.25,1.4; 19 3.75,-1.4; 20 4.25,1.4; 21 4.75,-1.4; 22 5.25,1.4 | smd 0.8 x 1.5: MP1 -6.25,1.4; MP2 -6.25,-1.4; MP3 6.25,-1.4; MP4 6.25,1.4
686110188622 = smd 0.6 x 1.9: 1 -4.5,2.825; 2 -3.5,2.825; 3 -2.5,2.825; 4 -1.5,2.825; 5 -0.5,2.825; 6 0.5,2.825; 7 1.5,2.825; 8 2.5,2.825; 9 3.5,2.825; 10 4.5,2.825 | smd 2.1 x 2.8: MP1 -7.65,0.475; MP2 7.65,0.475
M0805 = smd 1.3 x 1.6: 1 -0.95,0; 2 0.95,0
MA20-2 = drill 1.016 octagon: 1 -24.13,-1.27; 2 -24.13,1.27; 3 -21.59,-1.27; 4 -21.59,1.27; 5 -19.05,-1.27; 6 -19.05,1.27; 7 -16.51,-1.27; 8 -16.51,1.27; 9 -13.97,-1.27; 10 -13.97,1.27; 11 -11.43,-1.27; 12 -11.43,1.27; 13 -8.89,-1.27; 14 -8.89,1.27; 15 -6.35,-1.27; 16 -6.35,1.27; 17 -3.81,-1.27; 18 -3.81,1.27; 19 -1.27,-1.27; 20 -1.27,1.27; 21 1.27,-1.27; 22 1.27,1.27; 23 3.81,-1.27; 24 3.81,1.27; 25 6.35,-1.27; 26 6.35,1.27; 27 8.89,-1.27; 28 8.89,1.27; 29 11.43,-1.27; 30 11.43,1.27; 31 13.97,-1.27; 32 13.97,1.27; 33 16.51,-1.27; 34 16.51,1.27; 35 19.05,-1.27; 36 19.05,1.27; 37 21.59,-1.27; 38 21.59,1.27; 39 24.13,-1.27; 40 24.13,1.27
SOT229P700X180-4N = smd 1.31 x 0.93: 1 -3.345,2.29; 2 -3.345,0; 3 -3.345,-2.29 | smd 1.31 x 3.24: 4 3.345,0
OK-10F030-04_PACKAGE = smd 0.22 x 0.55: 1 -2.8,0.925; 2 -2.4,0.925; 3 -2,0.925; 4 -1.6,0.925; 5 -1.2,0.925; 6 -0.8,0.925; 7 -0.4,0.925; 8 0,0.925; 9 0.4,0.925; 10 0.8,0.925; 11 1.2,0.925; 12 1.6,0.925; 13 2,0.925; 14 2.4,0.925; 15 2.8,0.925; 16 2.8,-0.925; 17 2.4,-0.925; 18 2,-0.925; 19 1.6,-0.925; 20 1.2,-0.925; 21 0.8,-0.925; 22 0.4,-0.925; 23 0,-0.925; 24 -0.4,-0.925; 25 -0.8,-0.925; 26 -1.2,-0.925; 27 -1.6,-0.925; 28 -2,-0.925; 29 -2.4,-0.925; 30 -2.8,-0.925 | smd 0.6 x 0.55: 31 -3.4,0.925; 32 -3.39,-0.935; 33 3.42,0.935; 34 3.42,-0.925

### Placement (x,y rotation side)
5V_CARCASA  33.55,199.24 180 top
5V_MPU  14.4,169.4 270 top
5V_OPI  14.2,176.2 270 top
5V_SERVOS  8.9,169.2 270 top
10K_GND  32.5,164.1 0 top
+5V_LIDAR  96.1,48 180 top
C1  6.6,18.1 180 top
C2  2.2,32.2 90 top
C3  2.2,28.7 270 top
C4  2,5.7 0 top
C5  2,2.7 0 top
CAN_H_CARCASA  33.57,202.87 180 top
CAN_L_CARCASA  33.6,206.5 180 top
GND_CARCASA  33.53,195.58 180 top
GND_LIDAR  98.2,48 180 top
GND_ROTOR  3.1,169.2 0 top
GND_ROTOR1  3.1,176 270 top
GND_ROTOR2  3.1,162.3 270 top
GND_ROTOR3  8.8,176.1 90 top
IC1  8.1,23 180 top
IC2  25.8,36.8 180 top
J1  12.1,192.4 0 top
J2  22.3,14.6 180 top
J3  136.7,38.4 180 top
J4  6.9,67.3 90 top
LIGHTS_POWER  14.7,162.3 270 top
R0_GAT_OPI  32.5,161.4 180 top
R0_GAT_PORT  32.5,158.7 0 top
R1  18.8,36.7 90 top
R2  25.2,30 180 top
R3  32.5,166.8 180 top
R4  8.5,3 270 top
R5  2.7,19.8 270 top
R6  5.9,9.6 90 top
R7  2.7,9.6 270 top
R8  9,28 0 top
R9  14.3,28 0 top
R10  2.7,14.8 270 top
RX_LIDAR  94,48 180 top
SERVO_5V_CARG  33.46,188.2 0 top
SERVO_5V_GAT  33.4,179.4 0 top
SERVO_DATA_CARG  33.5,191.9 0 top
SERVO_DATA_GAT  33.4,172.1 0 top
SERVO_GND_CARG  33.4,183 0 top
SERVO_GND_GAT  33.4,175.8 0 top
SV1  108.5,64.23 90 top
TX_LIDAR  91.9,48 180 top
U1  11.4,35.3 90 top
U$1  134.4,58.1 0 top

### Tracks (layer width: path | path; a pad name or v marks a point on that pad's centre or on a via)
1.8V  (via drill 0.3 pad 0.2)
  Top 0.2: IC1.2 8.97,22.82 v9.4,22.4 | v3.7,28 C3.2 | 10.3,28 R8.2 9.95,26.55 | R9.2 15.3,27.95 15.7,27.95 15.7,26.8 14.2,25.3 11.8,25.3 10.6,26.5 10,26.5 9.95,26.55 | v9.4,26.3 9.7,26.3 9.95,26.55
  Top 0.406: 10.3,28 11.4,29.1 U1.2
  Bottom 0.2: v9.4,22.4 9.4,22.1 9.1,21.8 7.6,21.8 6.5,22.9 6.5,25.2 v3.7,28 4.8,28 6.2,26.6 8.5,26.6 8.8,26.3 v9.4,26.3
3V3  (via drill 0.3, 0.3 pad 0.2)
  Top 0.15: v16.57,31.95 U1.3
  Top 0.2: C5.2 v3.8,2.7 | v3.8,5.6 2.8,5.6 C4.2 R7.2 3.85,8.65 v4.3,8.2 | v6.6,4.3 8.15,4.3 R4.1 10.45,3.95 v10.5,4 | C2.2 2.3,33 v3.5,33 | v99.3,43.3 v97.5,41.5 | U$1.13 U$1.14 136.8,59.8 v137.1,60.1 | v17.05,11.81 J2.22
  POWER 0.2: v3.8,2.7 v3.8,5.6 | v4.3,8.2 4.3,6.6 v6.6,4.3 | v99.3,43.3 105,49 105,65.1 106.7,66.8 111.5,66.8 116.5,61.8 136.5,61.8 137.1,61.2 v137.1,60.1 | v97.5,41.5 9.1,41.5 3.5,35.9 v3.5,33 15.52,33 v16.57,31.95 | v16.57,31.95 | v10.5,4 13.12,4 17.04,7.92 v17.04,11.8 v17.05,11.81 16.57,12.29 v16.57,31.95
5V_MPUS
  POWER 0.406: 5V_MPU.MP 11.4,172.4 11.4,177 18.7,184.3 21.6,184.3 27.7,190.4 27.7,196.2 30.6,199.1 33.41,199.1 5V_CARCASA.MP
5V_OPI  (via drill 0.3)
  Top 0.406: J4.7 J4.6 J4.5 v8.7,66.8
  POWER 0.406: 41,66.8 41,50.2 41.7,49.5 95.6,49.5 96.1,49 +5V_LIDAR.1 96.1,44.9 100.9,40.1 SV1.2 SV1.4 | 5V_OPI.MP 14.2,173.8 19.9,168.1 19.8,110.1 41,98.4 41,67.11 41,66.8 | v8.7,66.8 41,66.8
5V_SERVOS  (via drill 0.3)
  Top 0.406: v20.9,166 v17,166
  POWER 0.406: v17,166 12.1,166 5V_SERVOS.MP | SERVO_5V_CARG.MP 33.56,188.1 34.9,188.1 35.8,187.2 35.8,181.1 34.1,179.4 SERVO_5V_GAT.MP 31.5,179.4 20.9,168.8 v20.9,166
CAM_CLK  (via drill 0.3, 0.3 pad 0.2)
  Top 0.15: v18.45,11.85 19.05,12.45 J2.18
  Top 0.2: v4.93,13.85 R10.2
  Bottom 0.15: v4.93,13.85 9.55,13.85 12.4,11 17.6,11 v18.45,11.85
CANH  (via drill 0.3)
  Top 0.406: v16.8,35.8 18.75,35.8 R1.1 21.35,35.75 21.7,36.1 23.18,36.1 IC2.7 24.69,36.16 25.2,36.67 v25.2,40.6 | J4.2 v7.7,63.8 | CAN_H_CARCASA.MP 25.57,202.87 18.8,196.1 18.8,192.75 J1.9
  Bottom 0.406: v16.8,35.8 5.3,35.8 0.8,40.3 0.8,53.4 0.9,53.5 5.3,53.5 7.7,55.9 v7.7,63.8 | v25.2,40.6 26,41.4 26,46 29.1,49.1 38.4,49.1 40.4,51.1 40.4,98.1 17.7,110.5 17.7,154.7 19.5,156.5 19.5,178 17.1,180.4 17.1,191.05 J1.9
CANL  (via drill 0.3)
  Top 0.406: v18.9,40.1 18.9,37.75 R1.2 20.45,37.65 20.7,37.4 23.21,37.4 IC2.6 | J4.3 6.6,64.8 v7.4,65.6 | CAN_L_CARCASA.MP 24.6,206.5 14.6,196.5 14.6,193.71 J1.8
  Bottom 0.406: v7.4,65.6 13.7,65.6 18.1,61.2 18.1,40.9 v18.9,40.1 28.8,50 38.2,50 39.7,51.5 39.7,97.5 16.9,110 16.9,155 18.8,156.9 18.8,176.9 13.3,182.4 13.3,192.33 J1.8
CLK  (via drill 0.3)
  Top 0.2: v1.6,17.4 2.4,17.4 2.7,17.1 R10.1 | U$1.11 135.6,59.6 v136,60.1
  Bottom 0.2: v1.6,17.4 0.9,16.7 0.9,11.5 2,10.4 7.5,10.4 12.6,5.3 34.1,5.3 39.6,10.8 39.6,21.7 42.4,24.5 98.4,24.5 105.6,31.7 140.5,31.7 145,36.2 145,56.2 138.8,62.4 137,62.4 136,61.4 v136,60.1
CLKN
  Top 0.15: U$1.23 134.4,50.5 117.6,33.7 41.4,33.7 25.9,18.2 24.3,18.2 23,16.9 23,14.8 24,13.8 24,13.25 J2.8
CLKP
  Top 0.15: U$1.22 134.8,55.3 134.6,55.1 134.6,50.4 117.7,33.5 41.5,33.5 26,18 24.4,18 23.5,17.1 23.5,16.05 J2.9
D0N
  Top 0.15: J2.2 27.05,18.15 41.8,32.9 118,32.9 135.2,50.1 135.2,54.8 136.8,56.4 U$1.17
D0P
  Top 0.15: U$1.16 137.2,56.5 135.4,54.7 135.4,50 118.1,32.7 41.9,32.7 28,18.8 28,15.1 28.3,14.8 28.3,14.5 27.7,13.9 27.7,12.4 27.3,12 26.9,12 26.55,12.35 J2.3
D1N
  Top 0.15: U$1.20 135.6,55.8 134.8,55 134.8,50.3 117.8,33.3 41.6,33.3 25.65,17.35 25.65,16.1 J2.5
D1P
  Top 0.15: J2.6 25.05,14.23 26.03,15.21 26.03,17.43 41.7,33.1 117.9,33.1 135,50.2 135,54.9 136,55.9 U$1.19
D2N
  Top 0.15: U$1.26 133.2,55.8 134,55 134,50.7 117.4,34.1 41.2,34.1 25.7,18.6 24.1,18.6 22.8,17.3 21.6,17.3 21,16.7 21,14.54 21.52,14.02 21.52,12.38 21.8,12.1 22.25,12.1 22.55,12.4 J2.11
D2P
  Top 0.15: U$1.25 133.6,55.7 134.2,55.1 134.2,50.6 117.5,33.9 41.3,33.9 25.8,18.4 24.2,18.4 22.9,17.1 22.41,17.1 22.05,16.74 J2.12
D3N
  Top 0.15: U$1.29 132,56.4 133.6,54.8 133.6,50.9 117.2,34.5 41,34.5 25.5,19 23.9,19 22.6,17.7 20.9,17.7 20.04,16.81 20.04,15.11 21.05,14.1 J2.14 21.1,13.25
D3P
  Top 0.15: U$1.28 132.4,56.3 133.8,54.9 133.8,50.8 117.3,34.3 41.1,34.3 25.6,18.8 24,18.8 22.7,17.5 21.2,17.5 20.6,16.9 20.6,16.05 J2.15
GND_PLANE  (via drill 0.3, 0.3 pad 0.2)  (1 unrouted)
  Top 0.15: J2.19 18.6,16.05 v18.6,17.2 | v24.6,14.8 24.6,16 J2.7 | J2.13 arc90 21.5,15.95 v21.5,14.8 | v27.6,14.8 27.6,15.95 arc90 J2.1 | v26,12 26,13.15 arc-90 J2.4 | 20,13.15 J2.16 | v23.04,12 J2.10 | v7.5,32 7.54,31.95 U1.1
  Top 0.2: C5.1 C4.1 1.3,11.8 v1.6,12.1 | U$1.4 132.8,58.9 | v26.1,28.4 26.1,29.95 R2.1 | 135.2,57.7 U$1.21 135.2,57.5 v134.6,58.1 134,57.5 U$1.24 | 135.2,57.7 U$1.10 135.2,59.5 v134.6,60.1 | U$1.4 U$1.27 132.8,57.5 132.6,57.7 131.8,57.7 131.6,57.5 U$1.30 | U$1.1 131.6,59.48 v131.01,60.07 | U$1.4 132.8,59.3 v133.6,60.1 | U$1.15 137.2,58.4 136.4,57.6 U$1.18 136.4,57.7 136.3,57.8 135.3,57.8 arc90 135.2,57.7 | 20,13.15 20,12.1 v20.2,11.9 | 18.6,16.05 18.6,14.9 18.9,14.6 19.69,14.6 20.04,14.25 J2.16 | v3.5,31.5 C2.1 C3.1
  Top 0.406: 27.07,36.16 IC2.2 28.41,36.1 31.6,36.1 v31.8,36.3 | 27.07,36.16 26.2,35.3 26.2,30.05 R2.1 arc90 26.1,29.95 | v35.1,167.5 34.4,166.8 R3.1 10K_GND.2 v35,164.1 | J4.10 J4.9 J4.8 2.8,69.8 2.6,69.6 2.6,66.1 2.9,65.8 J4.4 3,65.8 2.5,65.3 2.5,63.1 2.8,62.8 J4.1 4.08,60.98 v2.9,59.8 | v26.1,39.8 26.1,37.13 27.07,36.16
  GND_PLANE 0.2: 108.5,61.7 111.8,61.7 113.6,59.9 130.84,59.9 v131.01,60.07 | v133.6,60.1 v134.6,60.1 135.3,60.8 139,60.8 140.2,59.6 v140.2,44.3 | v1.6,12.1 8.3,12.1 13.4,17.2 v18.6,17.2 | v7.5,32 7,31.5 v3.5,31.5
  GND_PLANE 0.406: SV1.39 109.56,88.36 108.5,87.3 108.5,82.01 SV1.34 107.26,80.74 108.5,79.5 108.5,71.85 SV1.25 109.58,70.58 108.5,69.5 108.5,64.23 SV1.20 108.5,61.7 108.5,56.61 SV1.14 107.23,55.27 108.5,54 108.5,51.53 SV1.9 109.66,50.26 108.5,49.1 108.5,46.45 SV1.6 101.02,45.18 GND_LIDAR.1 98.2,44 94.3,40.1 34.8,40.1 34.6,39.9 | v35.1,167.5 35.9,168.3 35.9,174.6 34.7,175.8 SERVO_GND_GAT.MP 34.5,175.8 36,177.3 36,182 35.1,182.9 33.5,182.9 SERVO_GND_CARG.MP 34,183 36.1,185.1 36.1,194 34.5,195.6 33.55,195.6 GND_CARCASA.MP | 34.6,39.9 34.6,51.8 38.2,55.4 38.2,96.4 15.6,109.2 15.6,157.3 | 34.6,39.9 34.6,39.1 v31.8,36.3 | v2.9,59.8 2.9,54.1 11.2,45.8 | 11.2,45.8 22.6,45.8 26.1,42.3 v26.1,39.8 | v26.1,28.4 27.6,26.9 v27.6,14.8 v24.6,14.8 | v24.6,14.8 v21.5,14.8 v20.2,11.9 | 15.6,157.3 21.4,163.1 34.2,163.1 35,163.9 v35,164.1 | v24.6,14.8 v23.04,12 | v24.6,14.8 v26,12 | 15.6,157.3 8.1,157.3 GND_ROTOR2.MP GND_ROTOR.MP GND_ROTOR1.MP 8.7,176 GND_ROTOR3.MP 8.8,187.83 J1.5 J1.7 J1.10 | 11.2,45.8 10.7,45.8 6.6,41.7 6.6,32.9 v7.5,32
  pour GND_PLANE (isolate 0.254): -5.3,219 -5.3,-7.7 -5.1,-7.9 46.5,-7.9 46.5,15.4 156.4,15.2 155.8,106.8 93,106.8 93,59.6 47,59.8 47.1,218.1
GPIO-BTN1  (via drill 0.3)
  Top 0.2: J3.3 v139.2,39.6 | v117.1,47.8 117.1,47.72 SV1.7
  Bottom 0.2: 117.18,47.72 v117.1,47.8 | 117.1,47.83 v117.1,47.8 | v139.2,39.6 137.9,39.6 136.6,40.9 135.8,40.9 135.5,40.6 119.9,40.6 117.1,43.4 v117.1,47.8
GPIO-BTN2  (via drill 0.3)
  Top 0.2: J3.4 v138.2,41.6 | v122.8,55 v121.2,56.6
  Bottom 0.2: v121.2,56.6 113.6,64.2 108.7,64.2 107.4,65.5 SV1.22 | v122.8,55 136.2,41.6 v138.2,41.6
GPIO-LED1  (via drill 0.3)
  Top 0.2: J3.5 v137.2,44.2 | v123.6,56 v122.1,57.5
  Bottom 0.2: v122.1,57.5 118.4,61.2 118.4,81.4 113.98,85.82 SV1.37 | v123.6,56 135.4,44.2 v137.2,44.2
GPIO-LED2  (via drill 0.3)
  Top 0.2: J3.6 v136.2,40.3 | v121.5,53.9 v120,55.4 | v116.4,63.1 115,61.7 v115,61.6
  Bottom 0.2: v121.5,53.9 114.6,47 114.6,45.4 119.7,40.3 v136.2,40.3 | v120,55.4 115,60.4 v115,61.6 | SV1.36 108.51,82 111.2,82 116.4,76.8 v116.4,63.1
N$1
  Top 0.2: C1.1 8.5,19.3 IC1.1
N$6  (via drill 0.3)
  Top 0.2: IC1.7 IC1.8 7.08,22.47 5.4,20.79 5.4,19.8 4.45,18.85 R5.2 3.85,18.85 4.6,18.1 C1.2 5.8,18 v5.8,16.9 | R7.1 4.1,10.55 | 4.1,10.55 R6.2 | v4.1,12.9 4.1,10.55
  Bottom 0.2: v5.8,16.9 4.1,15.4 v4.1,12.9
N$7  (via drill 0.3, 0.3 pad 0.2)
  Top 0.15: J2.17 v19.55,17.19
  Top 0.2: R4.2 10.44,2.05 v10.46,2.03
  POWER 0.2: v10.46,2.03 15.65,2.03 19.55,5.93 v19.55,17.19
N$15  (via drill 0.3)
  Top 0.406: IC2.8 21.39,34.9 v20.7,34.2 | R2.2 24.28,30.03 v24.28,31.57
  POWER 0.406: v20.7,34.2 23.33,31.57 v24.28,31.57
OPI_CAN_RX  (via drill 0.3)
  Top 0.406: v30.8,38.7 IC2.4
  Bottom 0.406: SV1.3 109.77,42.77 111.8,44.8 111.8,45.5 110.77,46.45 106.66,46.44 99.7,39.5 31.6,39.5 v30.8,38.7
OPI_CAN_TX  (via drill 0.3)
  Top 0.406: v30.8,34.8 28.45,34.8 IC2.1
  Bottom 0.406: SV1.5 108.49,43.9 106.1,43.9 101.2,39 36.5,39 32.3,34.8 v30.8,34.8
PWM_GATILLO_OPI  (via drill 0.3)
  Top 0.406: R0_GAT_OPI.1 v34.9,161.4 | v29.2,159.9 19.6,159.9 v17,157.3 | v36.8,51.9 v36.8,48.2
  Bottom 0.406: v34.9,161.4 34.9,160.3 34.5,159.9 v29.2,159.9 | SV1.15 108.49,56.6 104.4,56.6 103.3,55.5 103.3,47.9 99.8,44.4 89.2,44.4 86.2,47.4 37.6,47.4 v36.8,48.2 | v17,157.3 15.5,155.8 15.5,108.9 38.2,96.5 38.2,53.3 v36.8,51.9
PWM_GATILLO_PORT  (via drill 0.3, 0.6)
  Top 0.406: v35.1,157.3 35.1,158.1 34.5,158.7 R0_GAT_PORT.2 | J1.4 8.3,192.41 8.3,184.9 13.8,179.4 20.8,179.4 v23.2,177
  Bottom 0.406: v35.1,157.3 34.8,157 30,157 23.2,163.8 v23.2,177
PWM_SYNC  (via drill 0.3)
  Top 0.406: v22.9,162 27.7,166.8 R3.2 v31.65,169.17 31.63,169.17 30.6,170.2 30.6,173.2 23.3,180.5 16,180.5 10.8,185.7 10.8,192.37 J1.6
  Bottom 0.406: SV1.32 102.7,78.2 101.1,76.6 101.1,51.1 99.9,49.9 41.9,49.9 41.2,50.6 41.2,98.6 18.4,111.1 18.4,154.3 20.1,156 20.1,159.2 v22.9,162
RX_LIDAR
  Bottom 0.2: RX_LIDAR.1 94,48.6 94.6,49.2 100.2,49.2 101.8,50.8 101.8,72.3 103.9,74.4 107.9,74.4 108.5,75 108.5,76.93 SV1.31
SCL1  (via drill 0.2 pad 0.2, 0.3, 0.3 pad 0.2)
  Top 0.2: v8.1,30.1 8.1,28.05 R8.1 8,27.95 v8,25.9 | IC1.3 9.62,23.18 v10.35,23.9 | v132.4,60.1 U$1.3
  Bottom 0.2: v8.1,30.1 8.5,30.5 15.1,30.5 15.6,30 28.2,30 36.8,38.6 111,38.6 113.2,40.8 113.2,47.3 127.9,62 131.3,62 132.4,60.9 v132.4,60.1 | v10.35,23.9 10,23.9 v8,25.9
SCL2  (via drill 0.3, 0.3 pad 0.2)
  Top 0.2: IC1.6 v4.81,23.17 3.82,23.17 2.7,22.05 R5.1 | v15.3,14.6 17.61,14.6 18.05,14.16 J2.20
  Bottom 0.2: v4.81,23.17 7.08,20.9 9.5,20.9 10.5,22 11.5,22 14.6,18.9 14.6,15.3 v15.3,14.6
SDA1  (via drill 0.3, 0.3 pad 0.2)
  Top 0.2: v13.36,29.65 R9.1 | R9.1 | R9.1 arc90 13.3,27.95 v13.3,26.5 | v10.3,25 9.5,25 8.6,24.1 8.6,23.6 IC1.4 | v133.4,58.1 133.4,58.3 133.2,58.5 U$1.5
  Bottom 0.2: v13.36,29.65 28.25,29.65 36.9,38.3 111.1,38.3 113.5,40.7 113.5,47.2 124.4,58.1 v133.4,58.1 | v13.3,26.5 12.8,26.5 11.3,25 v10.3,25
SDA2  (via drill 0.2 pad 0.2, 0.3)
  Top 0.15: J2.21 17.55,16.85 v11.9,22.5
  Top 0.2: IC1.5 6.48,23.52 v5.2,24.8 | R6.1 v5.9,7.1
  Bottom 0.2: v5.9,7.1 5.5,6.7 1.2,6.7 0.6,7.3 0.6,23.1 2.3,24.8 v5.2,24.8 6,24 6,22.7 7.4,21.3 9.2,21.3 10.4,22.5 v11.9,22.5
SERVO_CARGADOR_DATA  (via drill 0.3)
  Top 0.406: v37.8,51 v39.3,49
  POWER 0.406: v18,173.7 17.9,173.8 17.9,176.3 SERVO_DATA_CARG.MP
  Bottom 0.406: SV1.16 107.21,57.9 103.9,57.9 102.4,56.4 102.4,48.4 99.7,45.7 89.8,45.7 87.1,48.4 39.8,48.4 v39.3,49 | v18,173.7 18,157.2 16.2,155.4 16.2,109.5 38.9,97 38.98,96.94 38.98,52.18 v37.8,51
SERVO_GATILLO_DATA  (via drill 0.3)
  Top 0.406: v30.2,164.1 10K_GND.1 R0_GAT_OPI.2 R0_GAT_PORT.1
  Bottom 0.406: SERVO_DATA_GAT.MP 33.4,168.6 32.9,168.1 30.7,168.1 30.2,167.6 v30.2,164.1
TX_LIDAR
  Bottom 0.2: TX_LIDAR.1 91.9,48.8 92.6,49.5 100.1,49.5 101.5,50.9 101.5,74.7 103.6,76.8 107.8,76.8 108.5,77.5 108.5,79.47 SV1.33
VCC_3.3V  (via drill 0.3)
  Top 0.2: v135.2,33.5 J3.7
  Top 0.406: IC2.3 28.39,37.4 30.7,37.4 v30.8,37.3
  POWER 0.2: SV1.1 109.77,40.13
  POWER 0.406: v30.8,37.3 108.1,37.3 109.8,39 SV1.1 | 109.8,40.07 SV1.1 | v135.2,33.5 123.3,33.5 116.7,40.1 SV1.1
(copper drawn outside any net)
  shapes: Top area x4

### Text on the board
tNames: 2 | 4 | 6 | 8 | 10 | 1 | 3 | 5 | 7 | 9 | K1 - Zen V0.1 Rev.5.1 / by Cypress Technologies S.L. | GND | GND | GND | GND | CLK | 3V3 | 3V3 | GND | GND | D3N | D3P | GND | D2N | D2P | GND | CLKN | CLKP | GND | D1N | D1P | GND | D0N | D0P | GND | 3V3 | D3P | GND | D2N | CLKP | GND | D1N | D0P | GND | SDA2 | 3V3 | SCL2 | GND | D3N | D2P | GND | CLKN | D1P | GND | D0N | CAM_CLK